# EAGLE schematic 1700-0003_PowerBoard_REV-A (EAGLE 7.7.0)
DRAWING_DATE: 4/15/2022; DRAWING_TITLE: PQI380 UNIV. INTERFACE BRD; PART_NUMBER: 7000-0303; REV: R12

## Sheet 1 of 2
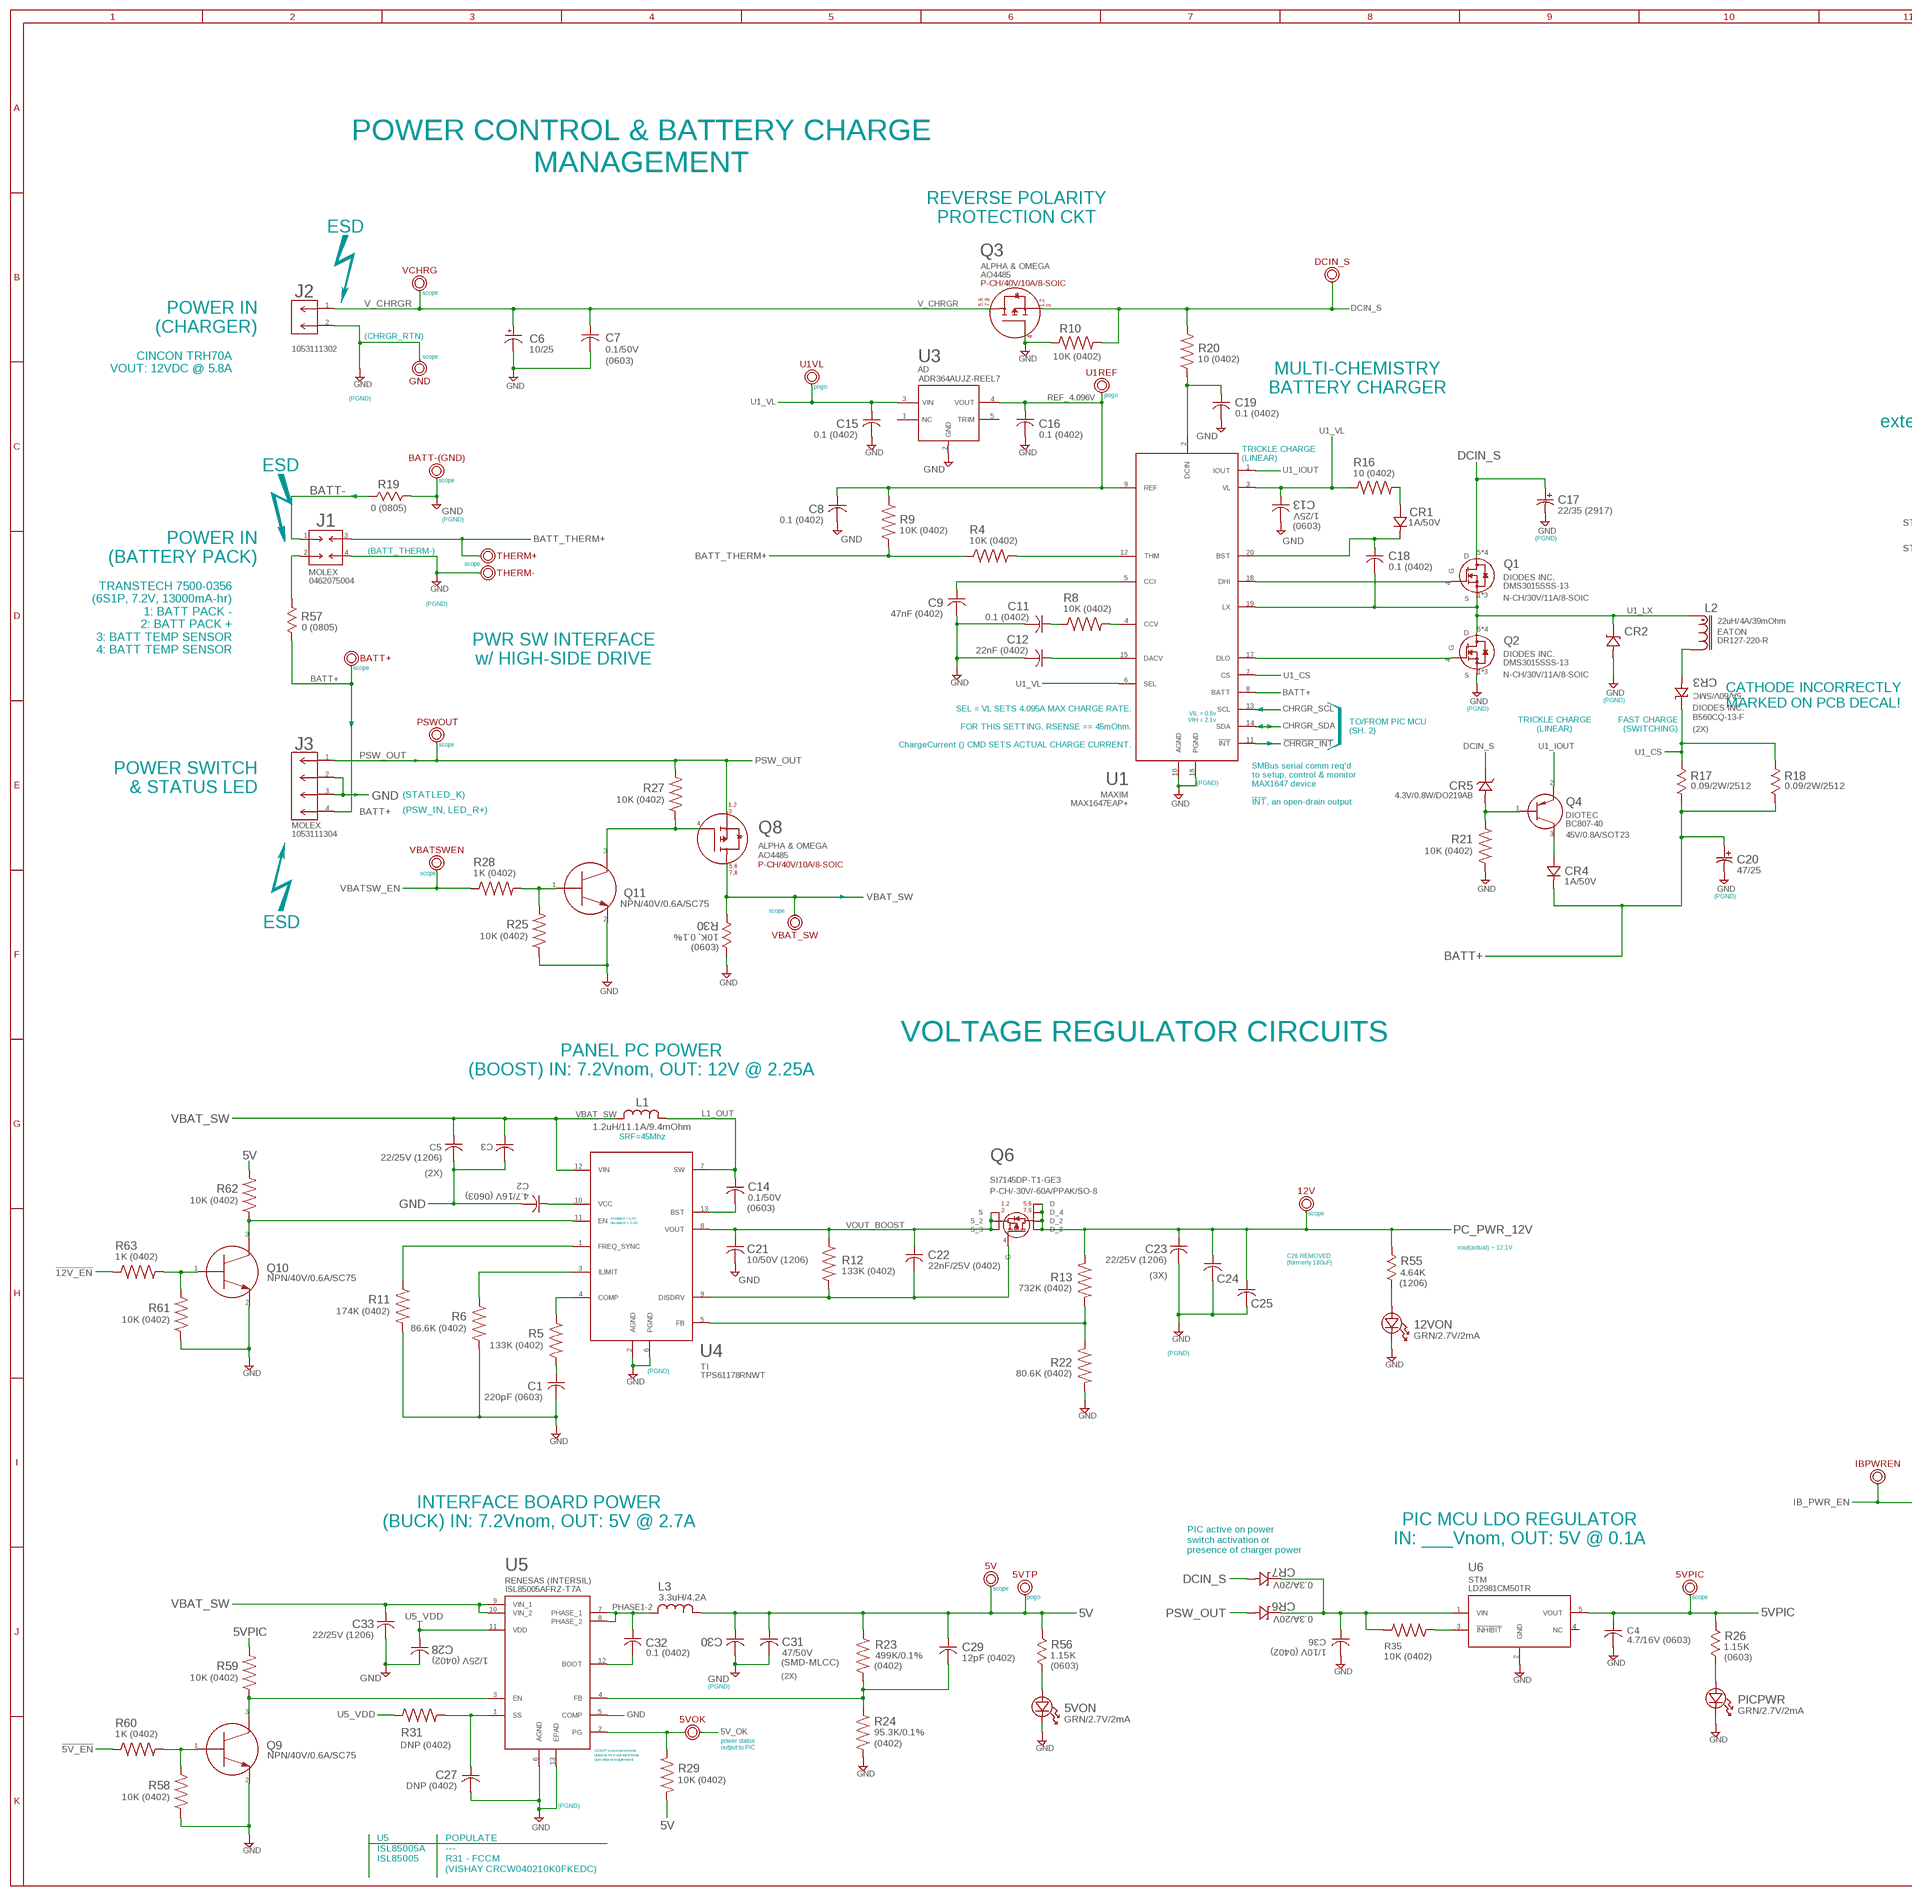
[diagram p0: schematic, sheet 1, part 1 of 2]
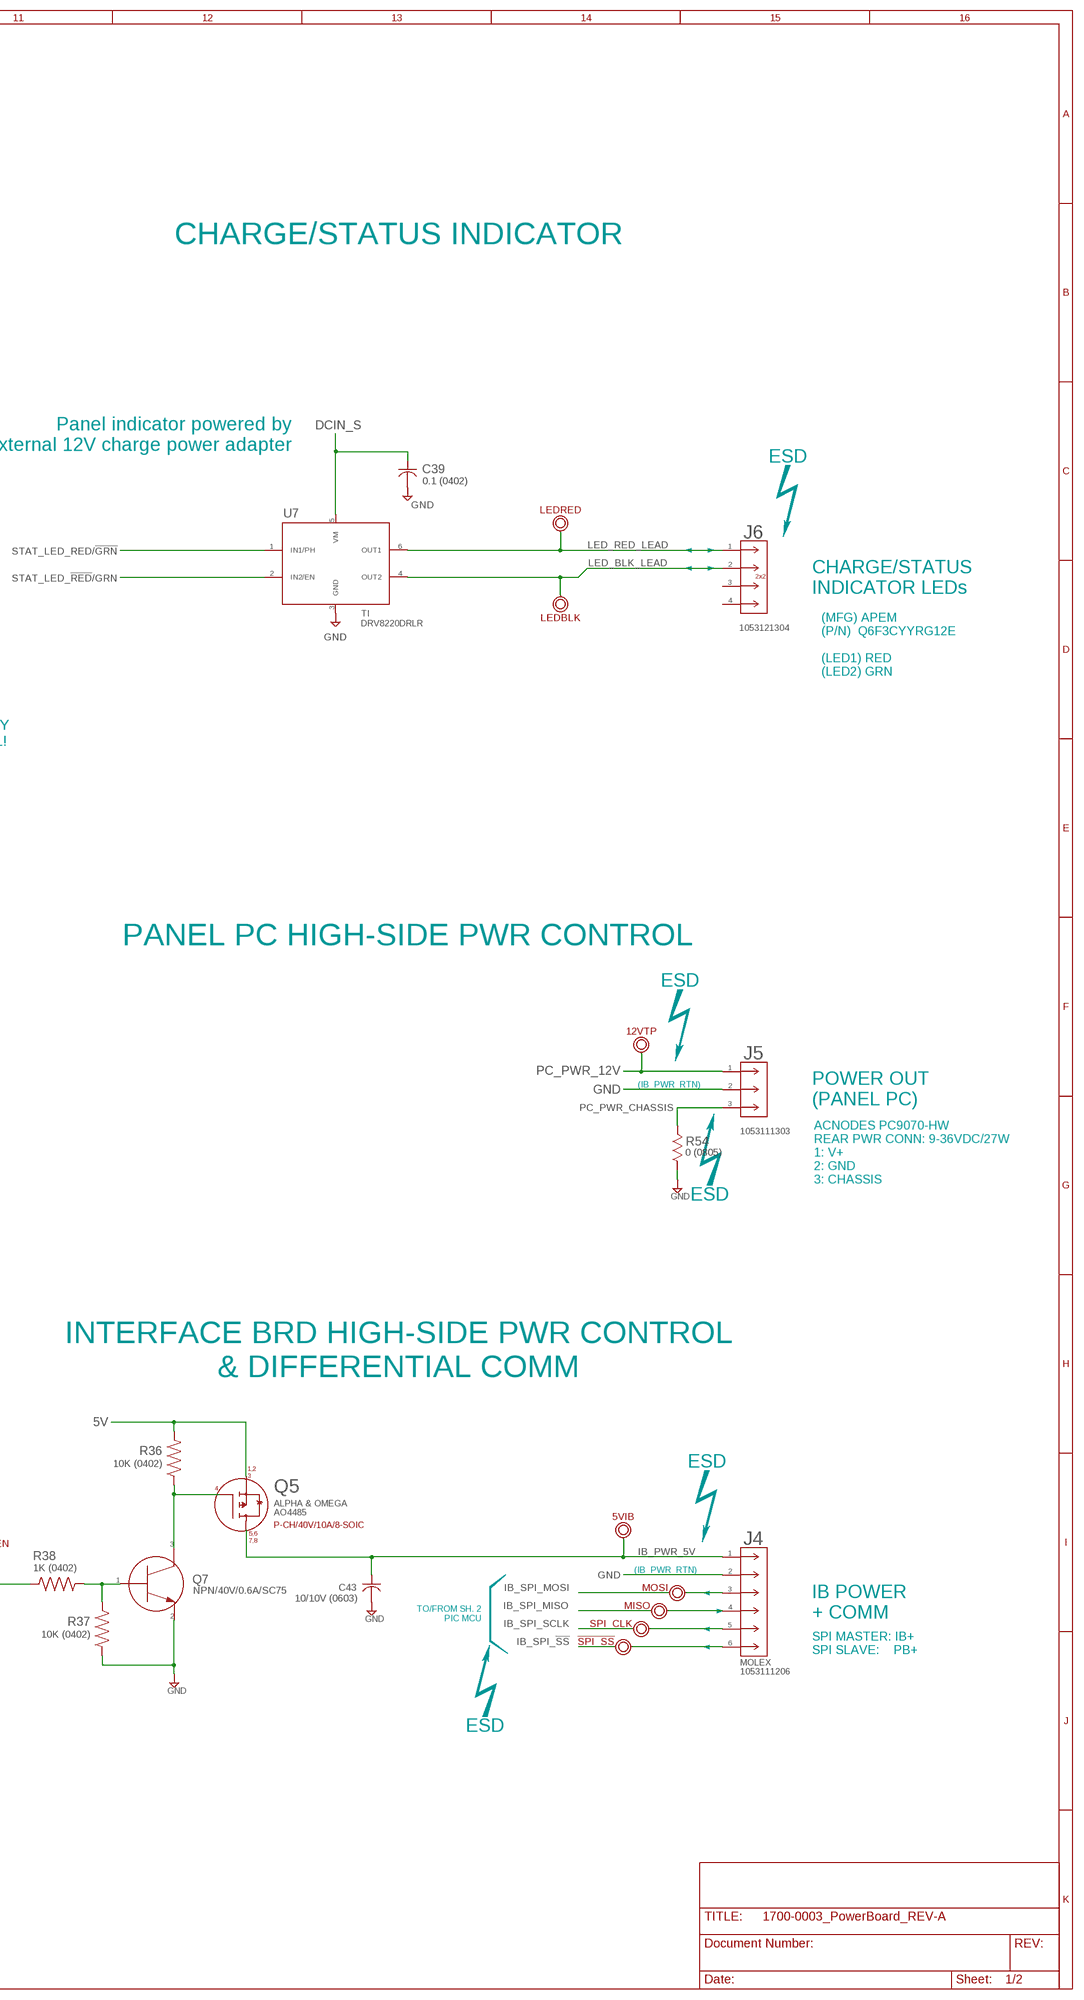
[diagram p1: schematic, sheet 1, part 2 of 2]
FRAME2 (FRAME_D_L): DWG-CO-NAME: TransTech Systems, Inc.; DWG-DATE: 4/22/2022; DWG-NUMBER: ____-____; DWG-REV: R-; DWG-TITLE: PQI380+ POWER BOARD SCHEMATIC; SIZE: D

### Parts
5V  TST_POINT_PTH_042-OCT  [TST_POINT_PTH_042-OCT]
5VIB  TST_POINT_PTH_20X40MIL  [TST_POINT_PTH_20X40MIL]
5VOK  TST_POINT_PTH_20X40MIL_2PIN  [TST_POINT_PTH_20X40MIL_2PIN]
5VON  GRN/2.7V/2mA  LED_0603  [LED_DIALIGHT_598_DIA]
5VPIC  TST_POINT_PTH_042-OCT  [TST_POINT_PTH_042-OCT]
5VTP  TST_POINT_PTH_20X40MIL  [TST_POINT_PTH_20X40MIL]
12V  TST_POINT_PTH_042-OCT  [TST_POINT_PTH_042-OCT]
12VON  GRN/2.7V/2mA  LED_0603  [LED_DIALIGHT_598_DIA]
12VTP  TST_POINT_PTH_20X40MIL  [TST_POINT_PTH_20X40MIL]
!SPI_SS!  TST_POINT_PTH_042_2PIN  [TST_POINT_PTH_042-OCT_2PIN]
BATT+  TST_POINT_PTH_042-OCT  [TST_POINT_PTH_042-OCT]
BATT-(GND)  TST_POINT_PTH_042-OCT  [TST_POINT_PTH_042-OCT]
C1  220pF (0603)  CAP_CER_0603_TDK  [CAP_C1608_TDK]
C2  4.7/16V (0603)  CAP_CER_0603_TDK  [CAP_C1608_TDK]
C3  22/25V (1206)  CAP_CER_1206_SAMSUNG  [CAP_CL31_SAM]
C4  4.7/16V (0603)  CAP_CER_0603_TDK  [CAP_C1608_TDK]
C5  22/25V (1206)  CAP_CER_1206_SAMSUNG  [CAP_CL31_SAM]
C6  10/25  CAP_SMT_EL_CORNELL-DUB_AFK106M25B12T-FCAP_AFK106M25B12T-F_CND-L  [CAP_AFK106M25B12T-F_CND-L]
C7  0.1/50V  CAP_CER_0603_TDK  [CAP_C1608_TDK]
C8  0.1 (0402)  CAP_CER_0402_MURATA  [G-155_MUR]
C9  47nF (0402)  CAP_CER_0402_MURATA  [G-155_MUR]
C11  0.1 (0402)  CAP_CER_0402_MURATA  [G-155_MUR]
C12  22nF (0402)  CAP_CER_0402_MURATA  [G-155_MUR]
C13  1/25V  CAP_CER_0603_TDK  [CAP_C1608_TDK]
C14  0.1/50V  CAP_CER_0603_TDK  [CAP_C1608_TDK]
C15  0.1 (0402)  CAP_CER_0402_MURATA  [G-155_MUR]
C16  0.1 (0402)  CAP_CER_0402_MURATA  [G-155_MUR]
C17  22/35 (2917)  CAP_TANT_KEMET_2917  [CAPMP7.6X4.3_3.1N_KEM]
C18  0.1 (0402)  CAP_CER_0402_MURATA  [G-155_MUR]
C19  0.1 (0402)  CAP_CER_0402_MURATA  [G-155_MUR]
C20  47/25  CAP_TANTALUM_KEMET_T495D  [CAPMP7.6X4.3_3.1N_KEM]
C21  10/50V (1206)  CAP_CER_1206_SAMSUNG  [CAP_CL31_SAM]
C22  22nF/25V (0402)  CAP_CER_0402_MURATA  [G-155_MUR]
C23  22/25V (1206)  CAP_CER_1206_SAMSUNG  [CAP_CL31_SAM]
C24  22/25V (1206)  CAP_CER_1206_SAMSUNG  [CAP_CL31_SAM]
C25  22/25V (1206)  CAP_CER_1206_SAMSUNG  [CAP_CL31_SAM]
C27  DNP (0402)  CAP_CER_0402_MURATA  [G-155_MUR]
C28  1/25V (0402)  CAP_CER_0402_MURATA  [G-155_MUR]
C29  12pF (0402)  CAP_CER_0402_MURATA  [G-155_MUR]
C30  47/50V (MLCC-SMD)  CAP_CER_TDK_CKG57  [CAP_CKG57N_TDK]
C31  47/50V  CAP_CER_TDK_CKG57  [CAP_CKG57N_TDK]
C32  0.1 (0402)  CAP_CER_0402_MURATA  [G-155_MUR]
C33  22/25V (1206)  CAP_CER_1206_SAMSUNG  [CAP_CL31_SAM]
C36  1/10V (0402)  CAP_CER_0402_MURATA  [G-155_MUR]
C39  0.1 (0402)  CAP_CER_0402_MURATA  [G-155_MUR]
C43  10/10V (0603)  CAP_CER_0603_TDK  [CAP_C1608_TDK]
CR1  1A/50V  DIODE_SMA  [SMA_DIO]
CR2  5A/60V/SMC  DIODE_SCHOTTKY_SMC  [CR_0CQ-13-F_DIO]
CR3  5A/60V/SMC  DIODE_SCHOTTKY_SMC  [CR_0CQ-13-F_DIO]
CR4  1A/50V  DIODE_SMA  [SMA_DIO]
CR5  4.3V/0.8W/DO219AB  DIODE_ZENER_VISHAY_BZD27C4V3P-E3-08  [DIO_BZD27C4V3P_VIS]
CR6  0.3A/20V  DIODE_SCHOTTKY_TOSHIBA_1SS404  [USC_TOS]
CR7  0.3A/20V  DIODE_SCHOTTKY_TOSHIBA_1SS404  [USC_TOS]
DCIN_S  TST_POINT_PTH_042-OCT  [TST_POINT_PTH_042-OCT]
GND  TST_POINT_PTH_042-OCT  [TST_POINT_PTH_042-OCT]
IBPWREN  TST_POINT_PTH_042-OCT  [TST_POINT_PTH_042-OCT]
J1  MOLEX_MINI-FIT-JR_462075004  [MOLEX_462075004]
J2  MOLEX_NANO-FIT_1053111302  [CON_1053111302_MOL]
J3  MOLEX_NANO-FIT_1053111304  [CON_1053111304_MOL]
J4  MOLEX_1053111206  [CON_1053111206_MOL]
J5  MOLEX_NANO-FIT_1053111303  [CON_1053111303_MOL]
J6  CON_MOLEX_NANOFIT_1053121304  [CON_1053121304]
L1  1.2uH/11.1A/9.4mOhm  INDUCTOR_COILCRAFT_XAL5030  [IND_XAL50XX_COC]
L2  22uH/4A/39mOhm  INDUCTOR_PWR_EATON_DR127-220-R  [DR127]
L3  3.3uH/4.2A  INDUCTOR_EATON_DRA74  [IND_CB_DRA74]
LEDBLK  TST_POINT_PTH_20X40MIL  [TST_POINT_PTH_20X40MIL]
LEDRED  TST_POINT_PTH_20X40MIL  [TST_POINT_PTH_20X40MIL]
MISO  TST_POINT_PTH_042_2PIN  [TST_POINT_PTH_042-OCT_2PIN]
MOSI  TST_POINT_PTH_042_2PIN  [TST_POINT_PTH_042-OCT_2PIN]
PICPWR  GRN/2.7V/2mA  LED_0603  [LED_DIALIGHT_598_DIA]
PSWOUT  TST_POINT_PTH_042-OCT  [TST_POINT_PTH_042-OCT]
Q1  N-CH/30V/11A/8-SOIC  MOSFET_N-CH_DIODES-INC_DMS3015SSS-13  [SOIC127P600X175-8N]
Q2  N-CH/30V/11A/8-SOIC  MOSFET_N-CH_DIODES-INC_DMS3015SSS-13  [SOIC127P600X175-8N]
Q3  P-CH/40V/10A/8-SOIC  MOSFET_P-CH_ALPHA&OMEGA_AO4485  [SOIC127P600X175-8N]
Q4  45V/0.8A/SOT23  TRANS_PNP_SOT-23-3_DIOTEC  [SOT-23-3_DIOTEC]
Q5  P-CH/40V/10A/8-SOIC  MOSFET_P-CH_ALPHA&OMEGA_AO4485  [SOIC127P600X175-8N]
Q6  P-CH/-30V/-60A/PPAK/SO-8  MOSFET_P-CH_VISHAY_SI7145DP-T1-GE3  [SON8_SI7135DP-T1-GE3_VIS]
Q7  NPN/40V/0.6A/SC75  MMBT2222ATT3G  [SC-75(SOT-416)_ONSEMI]
Q8  P-CH/40V/10A/8-SOIC  MOSFET_P-CH_ALPHA&OMEGA_AO4485  [SOIC127P600X175-8N]
Q9  NPN/40V/0.6A/SC75  MMBT2222ATT3G  [SC-75(SOT-416)_ONSEMI]
Q10  NPN/40V/0.6A/SC75  MMBT2222ATT3G  [SC-75(SOT-416)_ONSEMI]
Q11  NPN/40V/0.6A/SC75  MMBT2222ATT3G  [SC-75(SOT-416)_ONSEMI]
R4  10K (0402)  RES_0402_VISHAY  [RESC1005X35N]
R5  133K (0402)  RES_0402_VISHAY  [RESC1005X35N]
R6  86.6K (0402)  RES_0402_VISHAY  [RESC1005X35N]
R8  10K (0402)  RES_0402_VISHAY  [RESC1005X35N]
R9  10K (0402)  RES_0402_VISHAY  [RESC1005X35N]
R10  10K (0402)  RES_0402_VISHAY  [RESC1005X35N]
R11  174K (0402)  RES_0402_VISHAY  [RESC1005X35N]
R12  133K (0402)  RES_0402_VISHAY  [RESC1005X35N]
R13  732K (0402)  RES_0402_VISHAY  [RESC1005X35N]
R16  10 (0402)  RES_0402_VISHAY  [RESC1005X35N]
R17  0.09/2W/2512  RES_2512_TECONN  [RES_2512_TECONN]
R18  0.09/2W/2512  RES_2512_TECONN  [RES_2512_TECONN]
R19  0 (0805)  RES_0805_STACKPOLE  [STA_HCJ0805_STP]
R20  10 (0402)  RES_0402_VISHAY  [RESC1005X35N]
R21  10K (0402)  RES_0402_VISHAY  [RESC1005X35N]
R22  80.6K (0402)  RES_0402_VISHAY  [RESC1005X35N]
R23  499K/0.1%  RES_0402_VISHAY  [RESC1005X35N]
R24  95.3K/0.1%  RES_0402_VISHAY  [RESC1005X35N]
R25  10K (0402)  RES_0402_VISHAY  [RESC1005X35N]
R26  1.15K  RES_0603_STACKPOLE  [STA_RMCF0603_STP]
R27  10K (0402)  RES_0402_VISHAY  [RESC1005X35N]
R28  1K (0402)  RES_0402_VISHAY  [RESC1005X35N]
R29  10K (0402)  RES_0402_VISHAY  [RESC1005X35N]
R30  10K, 0.1%  RES_0603_STACKPOLE  [STA_RMCF0603_STP]
R31  DNP (0402)  RES_0402_VISHAY  [RESC1005X35N]
R35  10K (0402)  RES_0402_VISHAY  [RESC1005X35N]
R36  10K (0402)  RES_0402_VISHAY  [RESC1005X35N]
R37  10K (0402)  RES_0402_VISHAY  [RESC1005X35N]
R38  1K (0402)  RES_0402_VISHAY  [RESC1005X35N]
R54  0 (0805)  RES_0805_STACKPOLE  [STA_HCJ0805_STP]
R55  4.64K  RES_1206_YAGEO  [RC1206N_YAG]
R56  1.15K  RES_0603_STACKPOLE  [STA_RMCF0603_STP]
R57  0 (0805)  RES_0805_STACKPOLE  [STA_HCJ0805_STP]
R58  10K (0402)  RES_0402_VISHAY  [RESC1005X35N]
R59  10K (0402)  RES_0402_VISHAY  [RESC1005X35N]
R60  1K (0402)  RES_0402_VISHAY  [RESC1005X35N]
R61  10K (0402)  RES_0402_VISHAY  [RESC1005X35N]
R62  10K (0402)  RES_0402_VISHAY  [RESC1005X35N]
R63  1K (0402)  RES_0402_VISHAY  [RESC1005X35N]
SPI_CLK  TST_POINT_PTH_042_2PIN  [TST_POINT_PTH_042-OCT_2PIN]
THERM+  TST_POINT_PTH_042-OCT  [TST_POINT_PTH_042-OCT]
THERM-  TST_POINT_PTH_042-OCT  [TST_POINT_PTH_042-OCT]
U1  MAX1647EAP+  [21-0056C_20_MXM]
U1REF  TST_POINT_PTH_20X40MIL  [TST_POINT_PTH_20X40MIL]
U1VL  TST_POINT_PTH_20X40MIL  [TST_POINT_PTH_20X40MIL]
U3  AD_REFERENCE_ADR364AUJZ-REEL7  [UJ_5_ADI]
U4  REGULATOR_BOOST_TI_TPS61178RNWT  [RNW0013A]
U5  REGULATOR_BUCK_RENESAS_ISL85005AFRZ-T7A  [SON50P300X400X90-13N]
U6  IC_LDO_STM_LD2981CM50TR  [SOT23-5L_STM]
U7  IC_H-BRIDGE_TI_DRV8220DRLR  [SOT5X3-6_DRL_TEX]
VBAT_SW  TST_POINT_PTH_042-OCT  [TST_POINT_PTH_042-OCT]
VBATSWEN  TST_POINT_PTH_042-OCT  [TST_POINT_PTH_042-OCT]
VCHRG  TST_POINT_PTH_042-OCT  [TST_POINT_PTH_042-OCT]

### Nets
5V: 5V.P$1 5VTP.P$1 C29.1 C30.1 C31.1 L3.1 Q5.1(S) Q5.2(S) Q5.3(S) R23.1 R29.1 R36.2 R56.2 R62.2 ; also sheet 2
5V_OK: 5VOK.P$1 5VOK.P$2 R29.2 U5.2(PG) ; also sheet 2
5VPIC: 5VPIC.P$1 C4.1 R26.2 R59.2 U6.5(VOUT) ; also sheet 2
!5V_EN!: R60.1 ; also sheet 2
!12V_EN!: R63.1 ; also sheet 2
!CHRGR_INT!: U1.11(!INT) ; also sheet 2
$N36: C36.1 CR6.1(K) CR7.1(K) R35.2 U6.1(VIN)
$N99: J1.2 R57.2
BATT+: BATT+.P$1 C20.1 CR4.1 J3.4 R17.2 R18.2 R57.1 U1.8(BATT)
BATT-: J1.1 R19.2
BATT_THERM+: J1.3 R4.1 R9.2 THERM+.P$1
CHRGR_SCL: U1.13(SCL) ; also sheet 2
CHRGR_SDA: U1.14(SDA) ; also sheet 2
DCIN_S: C17.1 C39.1 CR5.2(K) CR7.2(A) DCIN_S.P$1 Q1.5(D) Q1.6(D) Q1.7(D) Q1.8(D) Q3.1(S) Q3.2(S) Q3.3(S) R10.2 R20.2 U7.5(VM) ; also sheet 2
GND: 5VON.1 12VON.1 BATT-(GND).P$1 C1.2 C2.2 C3.2 C4.2 C5.2 C6.2 C7.2 C8.2 C9.2 C11.2 C12.2 C13.2 C15.2 C16.2 C17.2 C19.2 C20.2 C21.2 C23.2 C24.2 C25.2 C27.2 C28.2 C30.2 C31.2 C33.2 C36.2 C39.2 C43.2 CR2.1(A) GND.P$1 J1.4 J2.2 J3.2 J3.3 J4.2 J5.2 PICPWR.1 Q2.1(S) Q2.2(S) Q2.3(S) Q3.4(G) Q7.2(E) Q9.2(E) Q10.2(E) Q11.2(E) R6.2 R10.1 R11.2 R19.1 R21.2 R22.2 R24.2 R25.1 R30.2 R37.1 R54.2 R58.1 R61.1 THERM-.P$1 U1.10(AGND) U1.16(PGND) U3.2(GND) U4.2(AGND) U4.6(PGND) U5.5(COMP) U5.6(AGND) U5.13(EPAD) U6.2(GND) U7.3(GND) ; also sheet 2
IB_PWR_5V: 5VIB.P$1 C43.1 J4.1 Q5.5(D) Q5.6(D) Q5.7(D) Q5.8(D)
IB_PWR_EN: IBPWREN.P$1 R38.1 ; also sheet 2
IB_SPI_!SS: !SPI_SS!.P$1 !SPI_SS!.P$2 J4.6 ; also sheet 2
IB_SPI_MISO: J4.4 MISO.P$1 MISO.P$2 ; also sheet 2
IB_SPI_MOSI: J4.3 MOSI.P$1 MOSI.P$2 ; also sheet 2
IB_SPI_SCLK: J4.5 SPI_CLK.P$1 SPI_CLK.P$2 ; also sheet 2
L1_OUT: C14.1 L1.1 U4.7(SW)
LED_BLK_LEAD: J6.2 LEDBLK.P$1 U7.4(OUT2)
LED_RED_LEAD: J6.1 LEDRED.P$1 U7.6(OUT1)
N$1: R5.1 U4.4(COMP)
N$2: C19.1 R20.1 U1.2(DCIN)
N$3: Q1.4(G) U1.18(DHI)
N$4: C1.1 R5.2
N$5: R4.2 U1.12(THM)
N$6: R6.1 U4.3(ILIMIT)
N$7: C2.1 U4.10(VCC)
N$8: R11.1 U4.1(FREQ_SYNC)
N$10: C9.1 U1.5(CCI)
N$11: R8.2 U1.4(CCV)
N$12: C11.1 R8.1
N$13: C12.1 U1.15(DACV)
N$14: CR4.2 Q4.3(C)
N$15: CR1.2 R16.2
N$16: Q2.4(G) U1.17(DLO)
N$17: C18.1 CR1.1 U1.20(BST)
N$18: CR3.1(A) L2.2
N$19: C14.2 U4.13(BST)
N$20: C22.2 Q6.4(G) R12.2 U4.9(DISDRV)
N$21: CR5.1(A) Q4.1(B) R21.1
N$22: Q8.4(G) Q11.3(C) R27.1
N$23: C27.1 R31.2 U5.1(SS)
N$24: R13.2 R22.1 U4.5(FB)
N$28: C32.2 U5.12(BOOT)
N$29: C29.2 R23.2 R24.1 U5.4(FB)
N$30: 5VON.2 R56.1
N$32: R35.1 U6.3(!INHIBIT!)
N$33: Q11.1(B) R25.2 R28.2
N$40: Q5.4(G) Q7.3(C) R36.1
N$41: Q7.1(B) R37.2 R38.2
N$63: 12VON.2 R55.2
N$64: PICPWR.2 R26.1
N$65: Q9.1(B) R58.2 R60.2
N$66: Q9.3(C) R59.1 U5.3(EN)
N$67: Q10.3(C) R62.1 U4.11(EN)
N$68: Q10.1(B) R61.2 R63.2
PC_PWR_12V: 12V.P$1 12VTP.P$1 C23.1 C24.1 C25.1 J5.1 Q6.5(D_3) Q6.6(D_2) Q6.7(D_4) Q6.8(D) R13.1 R55.1 ; also sheet 2
PC_PWR_CHASSIS: J5.3 R54.1
PHASE1-2: C32.1 L3.2 U5.7(PHASE_1) U5.8(PHASE_2)
PSW_OUT: CR6.2(A) J3.1 PSWOUT.P$1 Q8.1(S) Q8.2(S) Q8.3(S) R27.2 ; also sheet 2
REF_4.096V: C8.1 C16.1 R9.1 U1.9(REF) U1REF.P$1 U3.4(VOUT)
STAT_LED_!RED!/GRN: U7.2(IN2/EN) ; also sheet 2
STAT_LED_RED/!GRN!: U7.1(IN1/PH) ; also sheet 2
U1_CS: CR3.2(K) R17.1 R18.1 U1.7(CS)
U1_IOUT: Q4.2(E) U1.1(IOUT)
U1_LX: C18.2 CR2.2(K) L2.1 Q1.1(S) Q1.2(S) Q1.3(S) Q2.5(D) Q2.6(D) Q2.7(D) Q2.8(D) U1.19(LX)
U1_VL: C13.1 C15.1 R16.1 U1.3(VL) U1.6(SEL) U1VL.P$1 U3.3(VIN)
U5_VDD: C28.1 R31.1 U5.11(VDD)
V_CHRGR: C6.1 C7.1 J2.1 Q3.5(D) Q3.6(D) Q3.7(D) Q3.8(D) VCHRG.P$1
VBAT_SW: C3.1 C5.1 C33.1 L1.2 Q8.5(D) Q8.6(D) Q8.7(D) Q8.8(D) R30.1 U4.12(VIN) U5.9(VIN_1) U5.10(VIN_2) VBAT_SW.P$1
VBATSW_EN: R28.1 VBATSWEN.P$1 ; also sheet 2
VOUT_BOOST: C21.1 C22.1 Q6.1(S_3) Q6.2(S_2) Q6.3(S) R12.1 U4.8(VOUT)
Unconnected: J6.3 J6.4 U3.1(NC) U3.5(TRIM) U6.4(NC)

### Notes on the sheet
- POWER CONTROL & BATTERY CHARGE
  MANAGEMENT
- REVERSE POLARITY
  PROTECTION CKT
- ESD | CHARGE/STATUS INDICATOR
- scope
- POWER IN
  (CHARGER)
- (CHRGR_RTN)
- CINCON TRH70A
  VOUT: 12VDC @ 5.8A
- scope
- pogo
- MULTI-CHEMISTRY
  BATTERY CHARGER
- pogo
- (PGND)
- Panel indicator powered by
  external 12V charge power adapter
- ESD
- TRICKLE CHARGE
  (LINEAR)
- ESD
- scope
- (PGND)
- (PGND)
- POWER IN
  (BATTERY PACK)
- CHARGE/STATUS
  INDICATOR LEDs
- (BATT_THERM-)
- scope
- TRANSTECH 7500-0356
  (6S1P, 7.2V, 13000mA-hr)
  1: BATT PACK -
  2: BATT PACK +
  3: BATT TEMP SENSOR
  4: BATT TEMP SENSOR
- (MFG) APEM
  (P/N)  Q6F3CYYRG12E
  
  (LED1) RED
  (LED2) GRN
- (PGND)
- PWR SW INTERFACE
  w/ HIGH-SIDE DRIVE
- scope
- (PGND)
- CATHODE INCORRECTLY
  MARKED ON PCB DECAL!
- (PGND)
- TRICKLE CHARGE
  (LINEAR)
- FAST CHARGE
  (SWITCHING)
- VIL = 0.8v
  VIH = 2.1v
- TO/FROM PIC MCU
  (SH. 2)
- scope
- SEL = VL SETS 4.095A MAX CHARGE RATE.
  
  FOR THIS SETTING, RSENSE == 45mOhm.
  
  ChargeCurrent () CMD SETS ACTUAL CHARGE CURRENT.
- SMBus serial comm req'd
  to setup, control & monitor
  MAX1647 device
  
  !INT!, an open-drain output
- POWER SWITCH
  & STATUS LED
- (PGND)
- (STATLED_K)
- (PSW_IN, LED_R+)
- scope
- (PGND) | PANEL PC HIGH-SIDE PWR CONTROL
- scope
- ESD
- ESD
- (IB_PWR_RTN)
- POWER OUT
  (PANEL PC)
- VOLTAGE REGULATOR CIRCUITS
- ACNODES PC9070-HW
  REAR PWR CONN: 9-36VDC/27W
  1: V+
  2: GND
  3: CHASSIS
- PANEL PC POWER
  (BOOST) IN: 7.2Vnom, OUT: 12V @ 2.25A
- ESD
- SRF=45Mhz
- scope
- enabled >1.2V
  disabled < 0.4V
- vout(actual) ~ 12.1V
- C26 REMOVED 
  (formerly 180uF)
- INTERFACE BRD HIGH-SIDE PWR CONTROL
  & DIFFERENTIAL COMM
- (PGND)
- (PGND)
- ESD
- (IB_PWR_RTN)
- IB POWER
  + COMM
- INTERFACE BOARD POWER
  (BUCK) IN: 7.2Vnom, OUT: 5V @ 2.7A
- TO/FROM SH. 2
  PIC MCU
- PIC MCU LDO REGULATOR
  IN: ___Vnom, OUT: 5V @ 0.1A
- PIC active on power
  switch activation or
  presence of charger power
- SPI MASTER: IB+
  SPI SLAVE:    PB+
- scope
- pogo | scope
- ESD
- (PGND)
- power status
  output to PIC
- COMP external network
  optional for extended temp
  operational requirement
- (PGND)
- U5
  ISL85005A
  ISL85005
- POPULATE
  ---
  R31 - FCCM
  (VISHAY CRCW040210K0FKEDC)

## Sheet 2 of 2
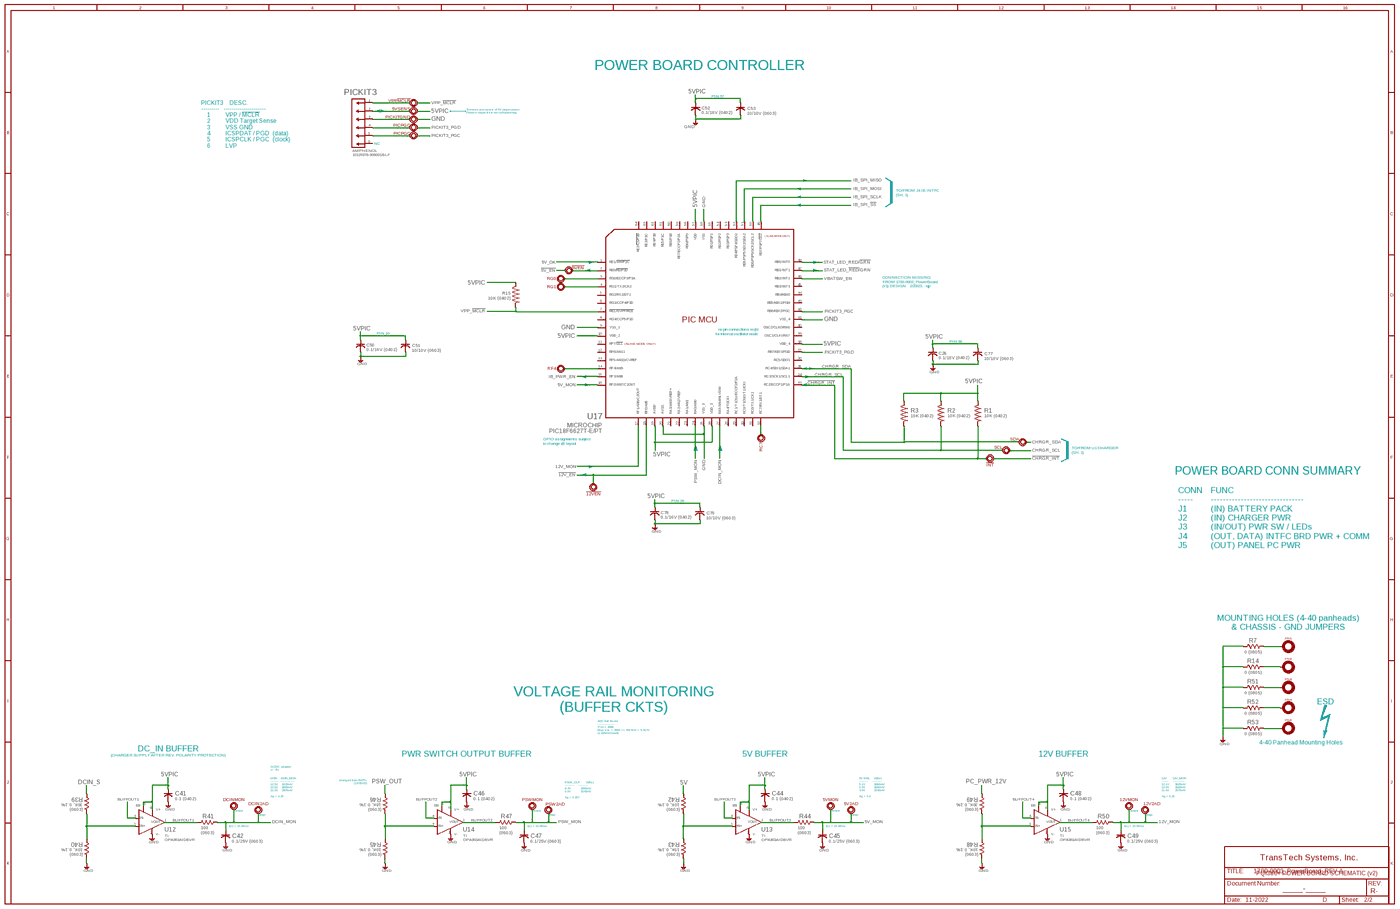
[diagram p2: schematic, sheet 2, overview]
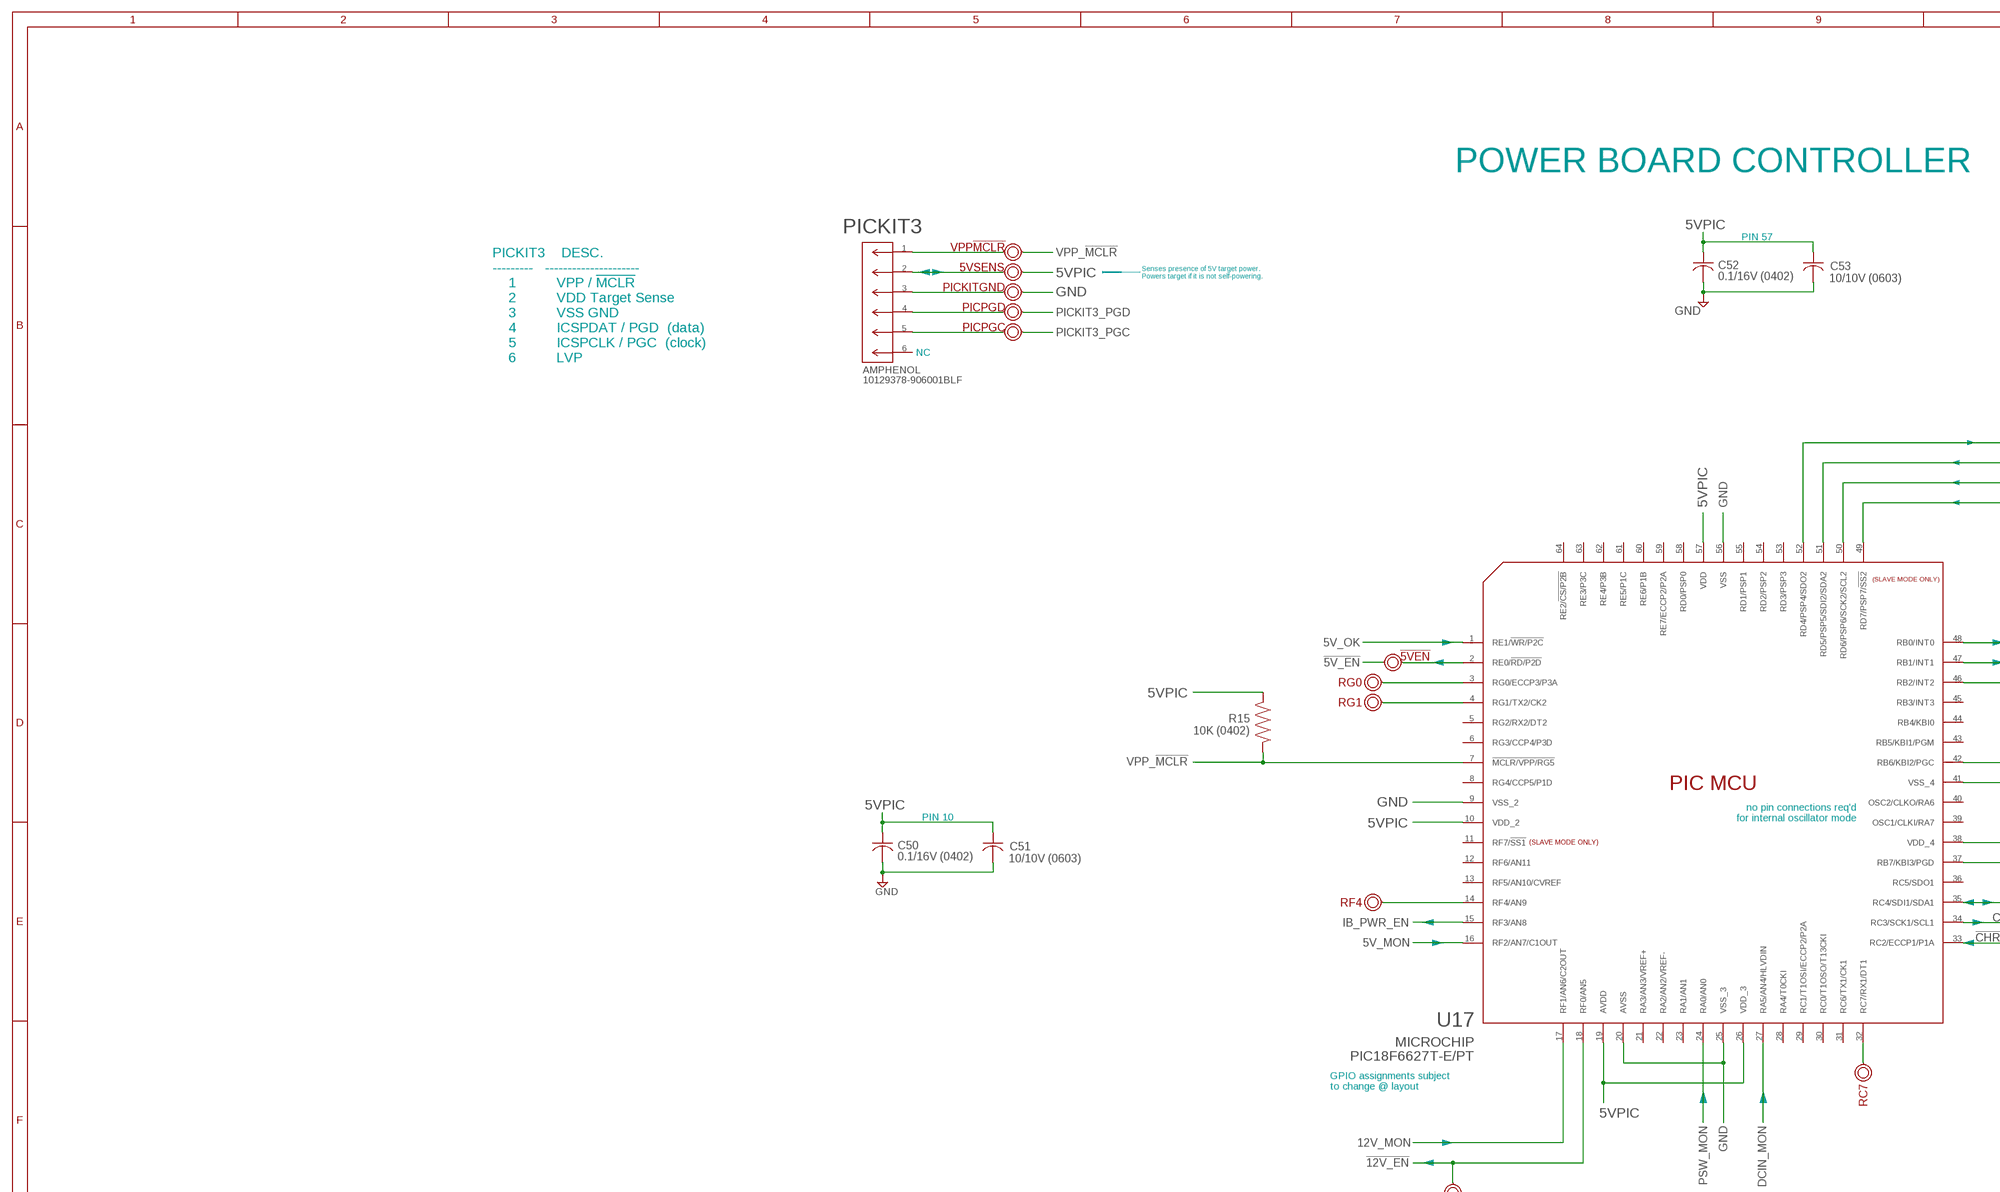
[diagram p3: schematic, sheet 2, part 1 of 4]
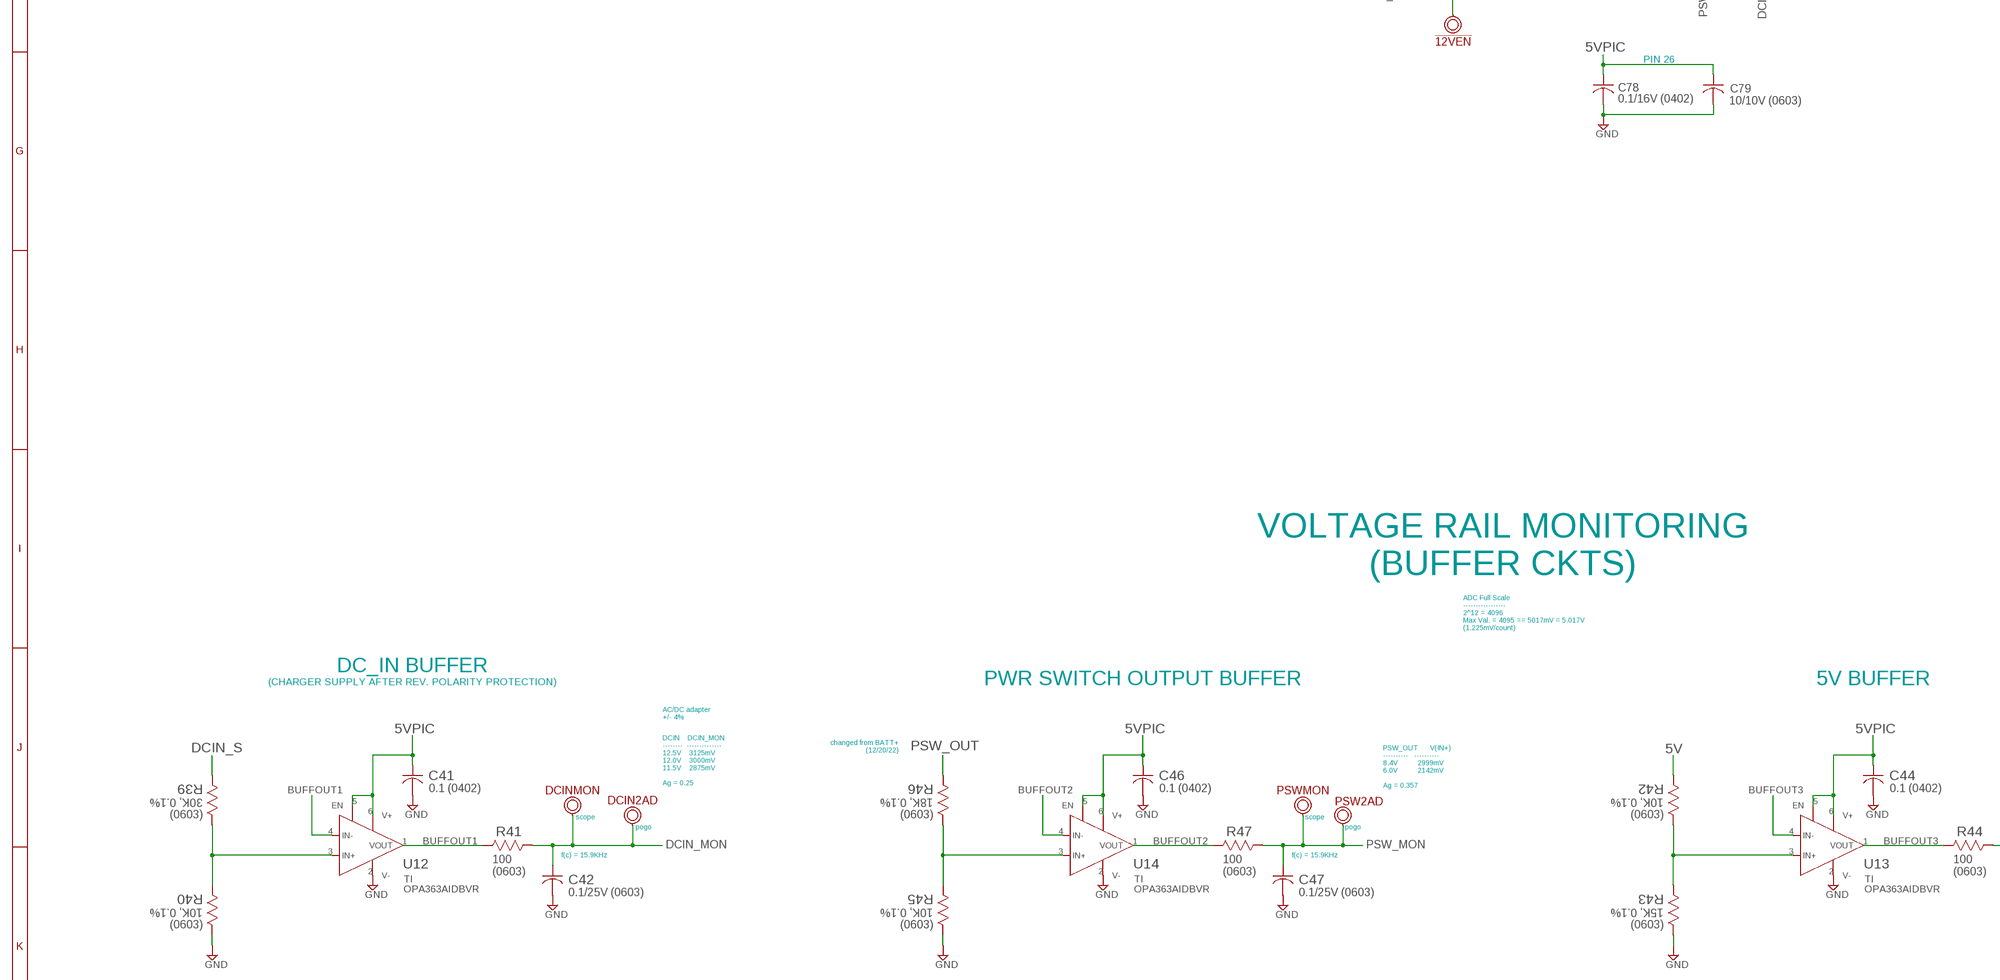
[diagram p4: schematic, sheet 2, part 2 of 4]
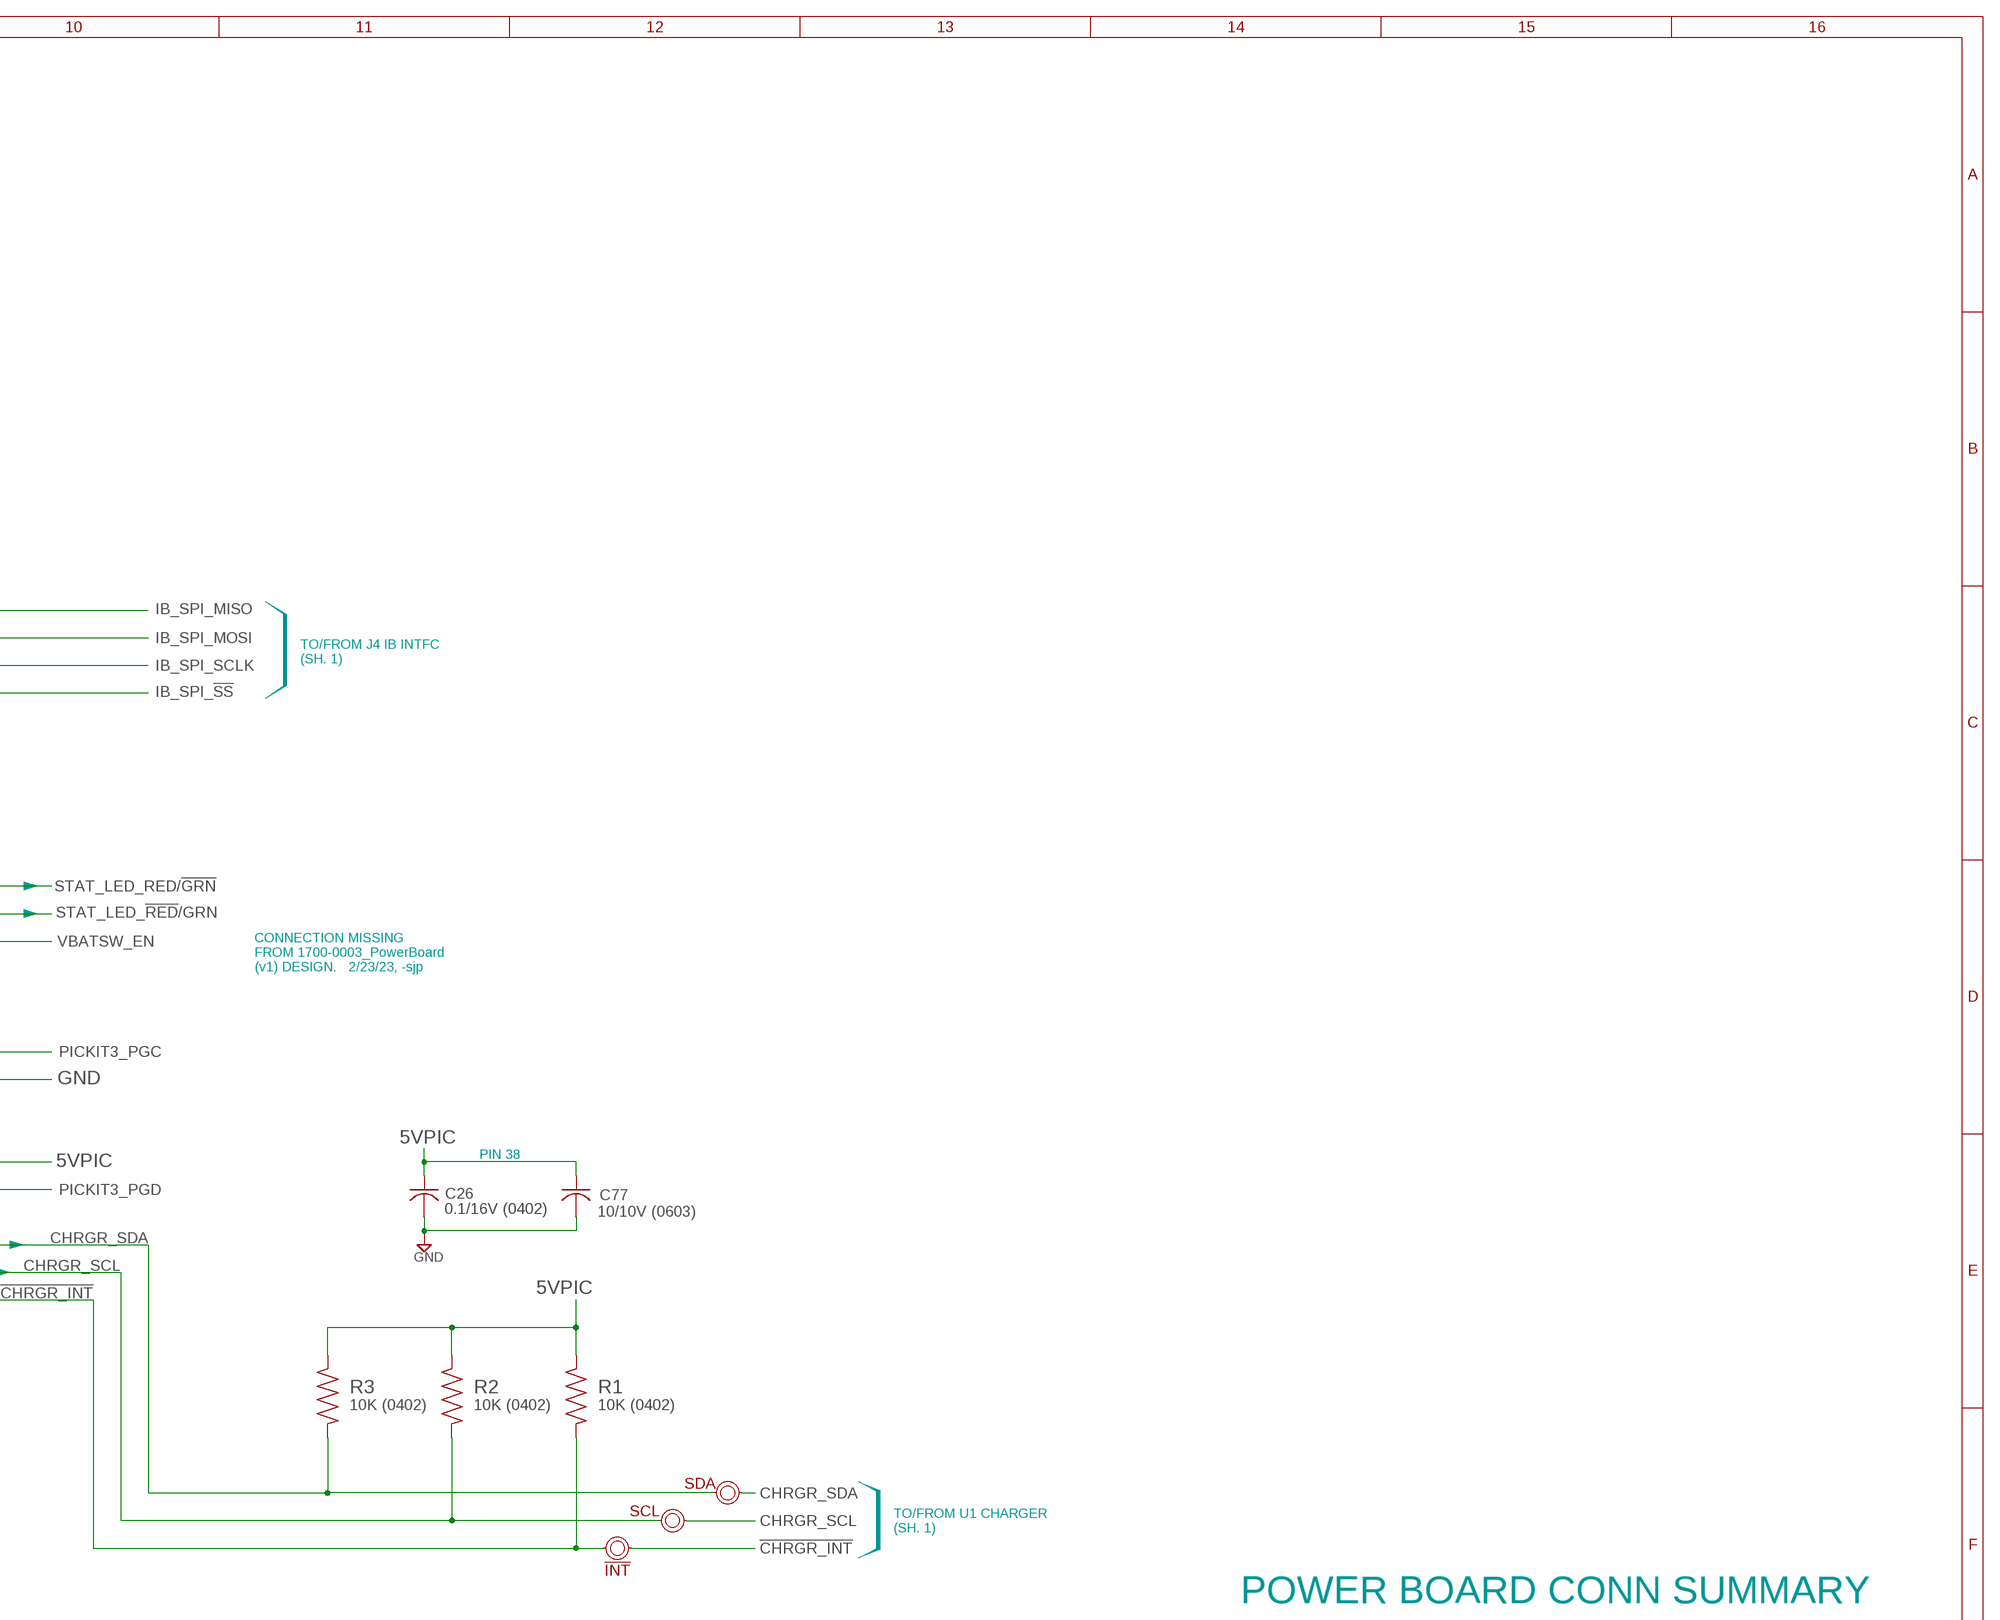
[diagram p5: schematic, sheet 2, part 3 of 4]
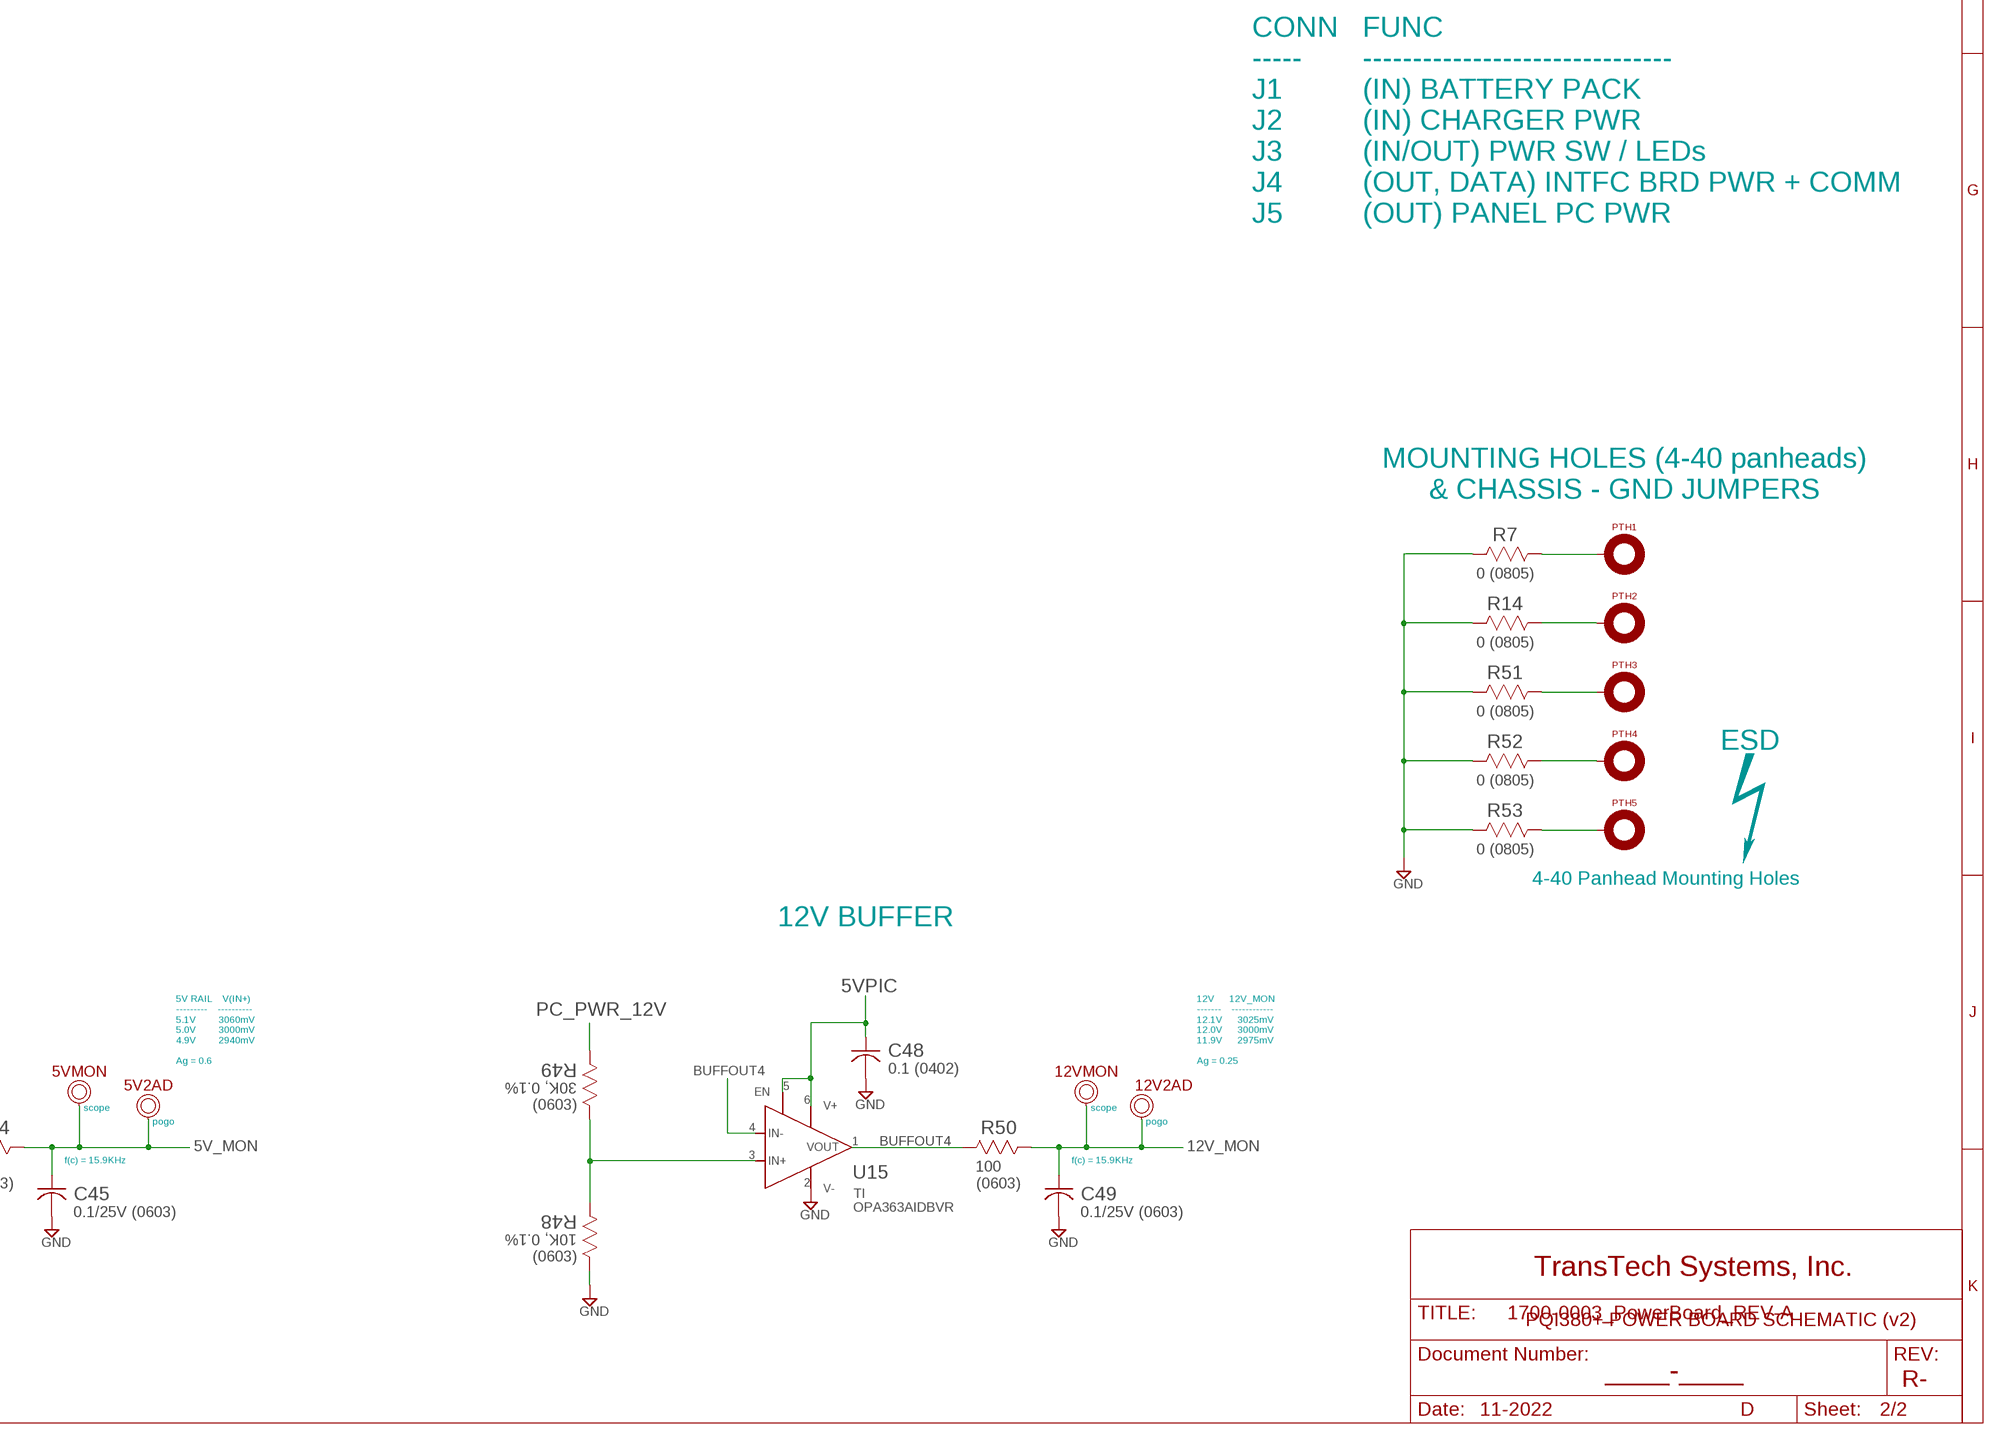
[diagram p6: schematic, sheet 2, part 4 of 4]
FRAME10 (FRAME_D_L): DWG-CO-NAME: TransTech Systems, Inc.; DWG-DATE: 11-2022; DWG-NUMBER: ____-____; DWG-REV: R-; DWG-TITLE: PQI380+ POWER BOARD SCHEMATIC (v2); SIZE: D

### Parts
5V2AD  TST_POINT_PTH_20X40MIL  [TST_POINT_PTH_20X40MIL]
5VMON  TST_POINT_PTH_042-OCT  [TST_POINT_PTH_042-OCT]
5VSENS  TST_POINT_PTH_20X40MIL_2PIN  [TST_POINT_PTH_20X40MIL_2PIN]
12V2AD  TST_POINT_PTH_20X40MIL  [TST_POINT_PTH_20X40MIL]
12VMON  TST_POINT_PTH_042-OCT  [TST_POINT_PTH_042-OCT]
!5VEN  TST_POINT_PTH_20X40MIL_2PIN  [TST_POINT_PTH_20X40MIL_2PIN]
!12VEN  TST_POINT_PTH_20X40MIL  [TST_POINT_PTH_20X40MIL]
!INT!  TST_POINT_PTH_20X40MIL_2PIN  [TST_POINT_PTH_20X40MIL_2PIN]
C26  0.1/16V (0402)  CAP_CER_0402_MURATA  [G-155_MUR]
C41  0.1 (0402)  CAP_CER_0402_MURATA  [G-155_MUR]
C42  0.1/25V (0603)  CAP_CER_0603_TDK  [CAP_C1608_TDK]
C44  0.1 (0402)  CAP_CER_0402_MURATA  [G-155_MUR]
C45  0.1/25V (0603)  CAP_CER_0603_TDK  [CAP_C1608_TDK]
C46  0.1 (0402)  CAP_CER_0402_MURATA  [G-155_MUR]
C47  0.1/25V (0603)  CAP_CER_0603_TDK  [CAP_C1608_TDK]
C48  0.1 (0402)  CAP_CER_0402_MURATA  [G-155_MUR]
C49  0.1/25V (0603)  CAP_CER_0603_TDK  [CAP_C1608_TDK]
C50  0.1/16V (0402)  CAP_CER_0402_MURATA  [G-155_MUR]
C51  10/10V (0603)  CAP_CER_0603_TDK  [CAP_C1608_TDK]
C52  0.1/16V (0402)  CAP_CER_0402_MURATA  [G-155_MUR]
C53  10/10V (0603)  CAP_CER_0603_TDK  [CAP_C1608_TDK]
C77  10/10V (0603)  CAP_CER_0603_TDK  [CAP_C1608_TDK]
C78  0.1/16V (0402)  CAP_CER_0402_MURATA  [G-155_MUR]
C79  10/10V (0603)  CAP_CER_0603_TDK  [CAP_C1608_TDK]
DCIN2AD  TST_POINT_PTH_20X40MIL  [TST_POINT_PTH_20X40MIL]
DCINMON  TST_POINT_PTH_042-OCT  [TST_POINT_PTH_042-OCT]
PICKIT3  CON_6POS_VERT-HDR_AMPH_10129378-906001  [CON6_1X6_VERT-HDR]
PICKITGND  TST_POINT_PTH_20X40MIL_2PIN  [TST_POINT_PTH_20X40MIL_2PIN]
PICPGC  TST_POINT_PTH_20X40MIL_2PIN  [TST_POINT_PTH_20X40MIL_2PIN]
PICPGD  TST_POINT_PTH_20X40MIL_2PIN  [TST_POINT_PTH_20X40MIL_2PIN]
PSW2AD  TST_POINT_PTH_20X40MIL  [TST_POINT_PTH_20X40MIL]
PSWMON  TST_POINT_PTH_042-OCT  [TST_POINT_PTH_042-OCT]
PTH1  PTH_4-40  [PTH_4-40]
PTH2  PTH_4-40  [PTH_4-40]
PTH3  PTH_4-40  [PTH_4-40]
PTH4  PTH_4-40  [PTH_4-40]
PTH5  PTH_4-40  [PTH_4-40]
R1  10K (0402)  RES_0402_VISHAY  [RESC1005X35N]
R2  10K (0402)  RES_0402_VISHAY  [RESC1005X35N]
R3  10K (0402)  RES_0402_VISHAY  [RESC1005X35N]
R7  0 (0805)  RES_0805_STACKPOLE  [STA_HCJ0805_STP]
R14  0 (0805)  RES_0805_STACKPOLE  [STA_HCJ0805_STP]
R15  10K (0402)  RES_0402_VISHAY  [RESC1005X35N]
R39  30K, 0.1%  RES_0603_STACKPOLE  [STA_RMCF0603_STP]
R40  10K, 0.1%  RES_0603_STACKPOLE  [STA_RMCF0603_STP]
R41  100  RES_0603_STACKPOLE  [STA_RMCF0603_STP]
R42  10K, 0.1%  RES_0603_STACKPOLE  [STA_RMCF0603_STP]
R43  15K, 0.1%  RES_0603_STACKPOLE  [STA_RMCF0603_STP]
R44  100  RES_0603_STACKPOLE  [STA_RMCF0603_STP]
R45  10K, 0.1%  RES_0603_STACKPOLE  [STA_RMCF0603_STP]
R46  18K, 0.1%  RES_0603_STACKPOLE  [STA_RMCF0603_STP]
R47  100  RES_0603_STACKPOLE  [STA_RMCF0603_STP]
R48  10K, 0.1%  RES_0603_STACKPOLE  [STA_RMCF0603_STP]
R49  30K, 0.1%  RES_0603_STACKPOLE  [STA_RMCF0603_STP]
R50  100  RES_0603_STACKPOLE  [STA_RMCF0603_STP]
R51  0 (0805)  RES_0805_STACKPOLE  [STA_HCJ0805_STP]
R52  0 (0805)  RES_0805_STACKPOLE  [STA_HCJ0805_STP]
R53  0 (0805)  RES_0805_STACKPOLE  [STA_HCJ0805_STP]
RC7  TST_POINT_PTH_042-OCT  [TST_POINT_PTH_042-OCT]
RF4  TST_POINT_PTH_042-OCT  [TST_POINT_PTH_042-OCT]
RG0  TST_POINT_PTH_042-OCT  [TST_POINT_PTH_042-OCT]
RG1  TST_POINT_PTH_042-OCT  [TST_POINT_PTH_042-OCT]
SCL  TST_POINT_PTH_20X40MIL_2PIN  [TST_POINT_PTH_20X40MIL_2PIN]
SDA  TST_POINT_PTH_20X40MIL_2PIN  [TST_POINT_PTH_20X40MIL_2PIN]
U12  IC_OPAMP_TI_OPA363AIDBVR  [DBV6]
U13  IC_OPAMP_TI_OPA363AIDBVR  [DBV6]
U14  IC_OPAMP_TI_OPA363AIDBVR  [DBV6]
U15  IC_OPAMP_TI_OPA363AIDBVR  [DBV6]
U17  PIC18F6627T-E/PT  [TQFP64_10X10MC_MCH]
VPP!MCLR!  TST_POINT_PTH_20X40MIL_2PIN  [TST_POINT_PTH_20X40MIL_2PIN]

### Nets
5V: R42.1 ; also sheet 1
5V_MON: 5V2AD.P$1 5VMON.P$1 C45.1 R44.2 U17.16(RF2/AN7/C1OUT)
5V_OK: U17.1(RE1/!WR/P2C) ; also sheet 1
5VPIC: 5VSENS.P$1 5VSENS.P$2 C26.1 C41.1 C44.1 C46.1 C48.1 C50.1 C51.1 C52.1 C53.1 C77.1 C78.1 C79.1 PICKIT3.2 R1.1 R2.1 R3.1 R15.1 U12.5(EN) U12.6(V+) U13.5(EN) U13.6(V+) U14.5(EN) U14.6(V+) U15.5(EN) U15.6(V+) U17.10(VDD_2) U17.19(AVDD) U17.26(VDD_3) U17.38(VDD_4) U17.57(VDD) ; also sheet 1
12V_MON: 12V2AD.P$1 12VMON.P$1 C49.1 R50.2 U17.17(RF1/AN6/C2OUT)
!5V_EN!: !5VEN.P$1 !5VEN.P$2 U17.2(RE0/!RD/P2D) ; also sheet 1
!12V_EN!: !12VEN.P$1 U17.18(RF0/AN5) ; also sheet 1
!CHRGR_INT!: !INT!.P$2 R1.2 U17.33(RC2/ECCP1/P1A) ; also sheet 1
BUFFOUT1: R41.1 U12.1(VOUT) U12.4(IN-)
BUFFOUT2: R47.1 U14.1(VOUT) U14.4(IN-)
BUFFOUT3: R44.1 U13.1(VOUT) U13.4(IN-)
BUFFOUT4: R50.1 U15.1(VOUT) U15.4(IN-)
CHRGR_SCL: R2.2 SCL.P$2 U17.34(RC3/SCK1/SCL1) ; also sheet 1
CHRGR_SDA: R3.2 SDA.P$2 U17.35(RC4/SDI1/SDA1) ; also sheet 1
DCIN_MON: C42.1 DCIN2AD.P$1 DCINMON.P$1 R41.2 U17.27(RA5/AN4/HLVDIN)
DCIN_S: R39.1 ; also sheet 1
GND: C26.2 C41.2 C42.2 C44.2 C45.2 C46.2 C47.2 C48.2 C49.2 C50.2 C51.2 C52.2 C53.2 C77.2 C78.2 C79.2 PICKIT3.3 PICKITGND.P$1 PICKITGND.P$2 R7.2 R14.2 R40.2 R43.2 R45.2 R48.2 R51.2 R52.2 R53.2 U12.2(V-) U13.2(V-) U14.2(V-) U15.2(V-) U17.9(VSS_2) U17.20(AVSS) U17.25(VSS_3) U17.41(VSS_4) U17.56(VSS) ; also sheet 1
IB_PWR_EN: U17.15(RF3/AN8) ; also sheet 1
IB_SPI_!SS: U17.49(RD7/PSP7/!SS2) ; also sheet 1
IB_SPI_MISO: U17.52(RD4/PSP4/SDO2) ; also sheet 1
IB_SPI_MOSI: U17.51(RD5/PSP5/SDI2/SDA2) ; also sheet 1
IB_SPI_SCLK: U17.50(RD6/PSP6/SCK2/SCL2) ; also sheet 1
N$9: RG0.P$1 U17.3(RG0/ECCP3/P3A)
N$25: SCL.P$1
N$27: !INT!.P$1
N$31: SDA.P$1
N$37: RG1.P$1 U17.4(RG1/TX2/CK2)
N$38: RF4.P$1 U17.14(RF4/AN9)
N$42: R39.2 R40.1 U12.3(IN+)
N$43: R42.2 R43.1 U13.3(IN+)
N$44: R45.1 R46.2 U14.3(IN+)
N$45: R48.1 R49.2 U15.3(IN+)
N$46: RC7.P$1 U17.32(RC7/RX1/DT1)
N$58: PTH1.P$1 R7.1
N$59: PTH2.P$1 R14.1
N$60: PTH3.P$1 R51.1
N$61: PTH4.P$1 R52.1
N$62: PTH5.P$1 R53.1
PC_PWR_12V: R49.1 ; also sheet 1
PICKIT3_PGC: PICKIT3.5 PICPGC.P$1 PICPGC.P$2 U17.42(RB6/KBI2/PGC)
PICKIT3_PGD: PICKIT3.4 PICPGD.P$1 PICPGD.P$2 U17.37(RB7/KBI3/PGD)
PSW_MON: C47.1 PSW2AD.P$1 PSWMON.P$1 R47.2 U17.24(RA0/AN0)
PSW_OUT: R46.1 ; also sheet 1
STAT_LED_!RED!/GRN: U17.47(RB1/INT1) ; also sheet 1
STAT_LED_RED/!GRN!: U17.48(RB0/INT0) ; also sheet 1
VBATSW_EN: U17.46(RB2/INT2) ; also sheet 1
VPP_!MCLR!: PICKIT3.1 R15.2 U17.7(!MCLR/VPP/RG5) VPP!MCLR!.P$1 VPP!MCLR!.P$2
Unconnected: PICKIT3.6 U17.5(RG2/RX2/DT2) U17.6(RG3/CCP4/P3D) U17.8(RG4/CCP5/P1D) U17.11(RF7/!SS1) U17.12(RF6/AN11) U17.13(RF5/AN10/CVREF) U17.21(RA3/AN3/VREF+) U17.22(RA2/AN2/VREF-) U17.23(RA1/AN1) U17.28(RA4/T0CKI) U17.29(RC1/T1OSI/ECCP2/P2A) U17.30(RC0/T1OSO/T13CKI) U17.31(RC6/TX1/CK1) U17.36(RC5/SDO1) U17.39(OSC1/CLKI/RA7) U17.40(OSC2/CLKO/RA6) U17.43(RB5/KBI1/PGM) U17.44(RB4/KBI0) U17.45(RB3/INT3) U17.53(RD3/PSP3) U17.54(RD2/PSP2) U17.55(RD1/PSP1) U17.58(RD0/PSP0) U17.59(RE7/ECCP2/P2A) U17.60(RE6/P1B) U17.61(RE5/P1C) U17.62(RE4/P3B) U17.63(RE3/P3C) U17.64(RE2/!CS/P2B)

### Notes on the sheet
- POWER BOARD CONTROLLER
- PIN 57
- Senses presence of 5V target power.
  Powers target if it is not self-powering.
- NC
- PICKIT3    DESC.
  ---------   ---------------------
      1          VPP / !MCLR
      2          VDD Target Sense
      3          VSS GND
      4          ICSPDAT / PGD  (data)
      5          ICSPCLK / PGC  (clock)
      6          LVP
- TO/FROM J4 IB INTFC
  (SH. 1)
- CONNECTION MISSING
  FROM 1700-0003_PowerBoard
  (v1) DESIGN.   2/23/23, -sjp
- no pin connections req'd
  for internal oscillator mode
- PIN 10
- PIN 38
- GPIO assignments subject
  to change @ layout
- TO/FROM U1 CHARGER
  (SH. 1)
- POWER BOARD CONN SUMMARY
- CONN
  -----
  J1
  J2
  J3
  J4
  J5
- FUNC
  -------------------------------
  (IN) BATTERY PACK
  (IN) CHARGER PWR
  (IN/OUT) PWR SW / LEDs
  (OUT, DATA) INTFC BRD PWR + COMM
  (OUT) PANEL PC PWR
- PIN 26
- MOUNTING HOLES (4-40 panheads)
  & CHASSIS - GND JUMPERS
- ESD
- VOLTAGE RAIL MONITORING
  (BUFFER CKTS)
- ADC Full Scale
  -----------------
  2^12 = 4096
  Max Val. = 4095 == 5017mV = 5.017V
  (1.225mV/count)
- 4-40 Panhead Mounting Holes
- DC_IN BUFFER
- (CHARGER SUPPLY AFTER REV. POLARITY PROTECTION) | PWR SWITCH OUTPUT BUFFER | 5V BUFFER | 12V BUFFER
- AC/DC adapter
  +/- 4%
- DCIN    DCIN_MON
  --------  --------------
  12.5V    3125mV
  12.0V    3000mV
  11.5V    2875mV
  
  Ag = 0.25
- 5V RAIL    V(IN+)
  ---------    ----------
  5.1V         3060mV
  5.0V         3000mV
  4.9V         2940mV
  
  Ag = 0.6
- 12V      12V_MON
  -------    ------------
  12.1V      3025mV
  12.0V      3000mV
  11.9V      2975mV
  
  Ag = 0.25
- PSW_OUT      V(IN+)
  ----------   ----------
  8.4V          2999mV
  6.0V          2142mV
  
  Ag = 0.357
- changed from BATT+
  (12/20/22)
- scope | scope | scope | scope
- pogo | pogo | pogo | pogo
- f(c) = 15.9KHz | f(c) = 15.9KHz | f(c) = 15.9KHz | f(c) = 15.9KHz

## Library data of the parts
5V 5VMON 5VPIC 12V 12VMON BATT+ BATT-(GND) DCIN_S DCINMON GND IBPWREN PSWMON PSWOUT RC7 RF4 RG0 RG1 THERM+ THERM- VBAT_SW VBATSWEN VCHRG = TTECH:TST_POINT_PTH_042-OCT; PART_DESC: PCB feature, test point, ID 42mil, OD 72mil
5V2AD 5VIB 5VTP 12V2AD 12VTP !12VEN DCIN2AD LEDBLK LEDRED PSW2AD U1REF U1VL = TTECH:TST_POINT_PTH_20X40MIL
5VOK 5VSENS !5VEN !INT! PICKITGND PICPGC PICPGD SCL SDA VPP!MCLR! = TTECH:TST_POINT_PTH_20X40MIL_2PIN; PART_DESC: PCB FEATURE, TEST POINT, ID 20MIL, OD 40MIL
5VON 12VON PICPWR = TTECH:LED_0603; COPYRIGHT: Copyright (C) 2022 Ultra Librarian. All rights reserved.; MANUFACTURER: DIALIGHT; MANUFACTURER_PART_NUMBER: 598-8081-107F; PART_DESC: LED GREEN CLEAR 0603 SMD
!SPI_SS! MISO MOSI SPI_CLK = TTECH:TST_POINT_PTH_042_2PIN; PART_DESC: PCB feature, test point, ID 42mil, OD 72mil
C1 = TTECH:CAP_CER_0603_TDK; MANUFACTURER: SAMSUNG; MANUFACTURER_PART_NUMBER: CL10C221JB8NNNC; PART_DESC: CAP CER 220PF 50V C0G/NP0 0603
C2 C4 = TTECH:CAP_CER_0603_TDK; MANUFACTURER: MURATA; MANUFACTURER_PART_NUMBER: GRM188Z71C475KE21D; PART_DESC: CAP CER 4.7UF 16V X7R 0603
C3 = TTECH:CAP_CER_1206_SAMSUNG; COPYRIGHT: Copyright (C) 2022 Ultra Librarian. All rights reserved.; MANUFACTURER: SAMSUNG; MANUFACTURER_PART_NUMBER: CL31A226KAHNNNE; PART_DESC: CAP CER 22UF 25V X5R 1206
C5 C33 = TTECH:CAP_CER_1206_SAMSUNG; COPYRIGHT: Copyright (C) 2022 Ultra Librarian. All rights reserved.; MANUFACTURER: SAMSUNG; MANUFACTURER_PART_NUMBER: CL31A226KAHNNNE; PART_DESC: CAP CER 22UF 25V X5R 1206; QTY_AREA: (2X)
C6 = TTECH:CAP_SMT_EL_CORNELL-DUB_AFK106M25B12T-F; COPYRIGHT: Copyright (C) 2023 Ultra Librarian. All rights reserved.; MANUFACTURER: Cornell Dubilier; MANUFACTURER_PART_NUMBER: AFK106M25B12T-F; PART_DESC: CAP ALUM 10UF 20% 25V SMD
C7 C14 = TTECH:CAP_CER_0603_TDK; MANUFACTURER: SAMSUNG; MANUFACTURER_PART_NUMBER: CL10B104KB8NNNC; PACKAGE: (0603); PART_DESC: CAP CER 0.1UF 50V X7R 0603
C8 C11 C15 C16 C18 C19 C26 C32 C39 C41 C44 C46 C48 C50 C52 C78 = TTECH:CAP_CER_0402_MURATA; MANUFACTURER: MURATA; MANUFACTURER_PART_NUMBER: GCM155R71C104KA55D; PART_DESC: CAP CER 0.1UF 16V X7R 0402
C9 = TTECH:CAP_CER_0402_MURATA; MANUFACTURER: MURATA; MANUFACTURER_PART_NUMBER: C0402C473K3REC7867; PART_DESC: CAP CER 0402 47NF 25V X7R 10%
C12 = TTECH:CAP_CER_0402_MURATA; MANUFACTURER: MURATA; MANUFACTURER_PART_NUMBER: C0402C223K5REC7411; PART_DESC: CAP CER 0402 22NF 50V X7R 10%
C13 = TTECH:CAP_CER_0603_TDK; MANUFACTURER: SAMSUNG; MANUFACTURER_PART_NUMBER: CL10B105KA8NNNC; PACKAGE: (0603); PART_DESC: CAP CER 1UF 25V X7R 0603
C17 = TTECH:CAP_TANT_KEMET_2917; COPYRIGHT: Copyright (C) 2022 Ultra Librarian. All rights reserved.; MANUFACTURER: KEMET; MANUFACTURER_PART_NUMBER: T495D226K035ATE300; PART_DESC: CAP TANT 22UF 10% 35V 2917
C20 = TTECH:CAP_TANTALUM_KEMET_T495D; COPYRIGHT: Copyright (C) 2022 Ultra Librarian. All rights reserved.; MANUFACTURER: KEMET; MANUFACTURER_PART_NUMBER: T495D476K025ATE250; PART_DESC: CAP TANT 47UF 10% 25V 2917
C21 = TTECH:CAP_CER_1206_SAMSUNG; COPYRIGHT: Copyright (C) 2022 Ultra Librarian. All rights reserved.; MANUFACTURER: SAMSUNG; MANUFACTURER_PART_NUMBER: CL31B106KBHNNNE; PART_DESC: CAP CER 10UF 50V X7R 1206; QTY_AREA: (__X)
C22 = TTECH:CAP_CER_0402_MURATA; MANUFACTURER: MURATA; MANUFACTURER_PART_NUMBER: GRM155R71E223KA61D; PART_DESC: Multilayer Ceramic Capacitors MLCC - SMD/SMT .022UF 25V 10% 0402
C23-C25 = TTECH:CAP_CER_1206_SAMSUNG; COPYRIGHT: Copyright (C) 2022 Ultra Librarian. All rights reserved.; MANUFACTURER: SAMSUNG; MANUFACTURER_PART_NUMBER: GCM31CC81E226KE11L; PART_DESC: CAP CER 22UF 25V X6S 1206; QTY_AREA: (3X)
C27 = TTECH:CAP_CER_0402_MURATA; MANUFACTURER: MURATA; PART_DESC: --- DO NOT POPULATE ---
C28 = TTECH:CAP_CER_0402_MURATA; MANUFACTURER: MURATA; MANUFACTURER_PART_NUMBER: GRM155R61E105KA12D; PART_DESC: CAP CER 1UF 25V X5R 0402
C29 = TTECH:CAP_CER_0402_MURATA; MANUFACTURER: MURATA; MANUFACTURER_PART_NUMBER: C0402C120K5RAC7867; PART_DESC: CAP CER 12PF 50V X7R 0402
C30 = TTECH:CAP_CER_TDK_CKG57; COPYRIGHT: Copyright (C) 2022 Ultra Librarian. All rights reserved.; MANUFACTURER: TDK; MANUFACTURER_PART_NUMBER: CKG57NX7R1H476M500JH; PART_DESC: 47 µF ±20% 50V Ceramic Capacitor X7R Stacked SMD, 2 J-Lead; QTY_AREA: (2X)
C31 = TTECH:CAP_CER_TDK_CKG57; COPYRIGHT: Copyright (C) 2022 Ultra Librarian. All rights reserved.; MANUFACTURER: TDK; MANUFACTURER_PART_NUMBER: CKG57NX7R1H476M500JH; PACKAGE: (SMD-MLCC); PART_DESC: 47 µF ±20% 50V Ceramic Capacitor X7R Stacked SMD, 2 J-Lead; QTY_AREA: (2X)
C36 = TTECH:CAP_CER_0402_MURATA; MANUFACTURER: MURATA; MANUFACTURER_PART_NUMBER: GRM155C81C225ME15D; PART_DESC: CAP CER 2.2UF 16V X6S 0402
C42 C45 C47 C49 = TTECH:CAP_CER_0603_TDK; MANUFACTURER: KEMET; MANUFACTURER_PART_NUMBER: C0603C104K3RAC7867; PART_DESC: CAP CER 0.1UF 25V X7R 0603
C43 C51 C53 C77 C79 = TTECH:CAP_CER_0603_TDK; MANUFACTURER: MURATA; MANUFACTURER_PART_NUMBER: GRM188D71A106KA73D; PART_DESC: CAP CER 10UF 10V X7T 0603
CR1 CR4 = TTECH:DIODE_SMA; COPYRIGHT: Copyright (C) 2022 Ultra Librarian. All rights reserved.; MANUFACTURER: DIODES INC.; MANUFACTURER_PART_NUMBER: ES1A-13-F; PART_DESC: DIODE GEN PURP 50V 1A SMA
CR2 CR3 = TTECH:DIODE_SCHOTTKY_SMC; COPYRIGHT: Copyright (C) 2022 Ultra Librarian. All rights reserved.; MANUFACTURER: DIODES INC.; MANUFACTURER_PART_NUMBER: B560CQ-13-F; PART_DESC: DIODE SCHOTTKY 60V 5A SMC; QTY_AREA: (2X)
CR5 = TTECH:DIODE_ZENER_VISHAY_BZD27C4V3P-E3-08; COPYRIGHT: Copyright (C) 2022 Ultra Librarian. All rights reserved.; MANUFACTURER: VISHAY; MANUFACTURER_PART_NUMBER: BZD27C4V3P-E3-08; PART_DESC: DIODE ZENER 4.3V 800MW DO219AB
CR6 CR7 = TTECH:DIODE_SCHOTTKY_TOSHIBA_1SS404; COPYRIGHT: Copyright (C) 2022 Ultra Librarian. All rights reserved.; MANUFACTURER: TOSHIBA; MANUFACTURER_PART_NUMBER: 1SS404; PART_DESC: DIODE SCHOTTKY 20V 300MA USC
J1 = TTECH:MOLEX_MINI-FIT-JR_462075004; MANUFACTURER: MOLEX; MANUFACTURER_PART_NUMBER: 0462075004; PART_DESC: MINI-FIT JR LCP VERT. HDR PEGS 4
J2 = TTECH:MOLEX_NANO-FIT_1053111302; COPYRIGHT: Copyright (C) 2022 Ultra Librarian. All rights reserved.; MANUFACTURER: MOLEX; MANUFACTURER_PART_NUMBER: 1053111302; PART_DESC: CONN HEADER VERT 2POS 2.5MM
J3 = TTECH:MOLEX_NANO-FIT_1053111304; MANUFACTURER: MOLEX; MANUFACTURER_PART_NUMBER: 1053111304; PART_DESC: HEADER, NANOFIT, VERT, 4 POS 2.5mm
J4 = TTECH:MOLEX_1053111206; COPYRIGHT: Copyright (C) 2022 Ultra Librarian. All rights reserved.; MANUFACTURER: MOLEX; MANUFACTURER_PART_NUMBER: 1053111206; PART_DESC: CONN HEADER VERT 6POS 2.5MM
J5 = TTECH:MOLEX_NANO-FIT_1053111303; COPYRIGHT: Copyright (C) 2022 Ultra Librarian. All rights reserved.; MANUFACTURER: MOLEX; MANUFACTURER_PART_NUMBER: 1053111303; PART_DESC: CONN HEADER VERT 3POS 2.5MM
J6 = TTECH:CON_MOLEX_NANOFIT_1053121304; MANUFACTURER: MOLEX; MANUFACTURER_PART_NUMBER: 1053121304; PART_DESC: CONN HEADER VERT 4POS 2.5MM
L1 = TTECH:INDUCTOR_COILCRAFT_XAL5030; COPYRIGHT: Copyright (C) 2022 Ultra Librarian. All rights reserved.; MANUFACTURER: COILCRAFT; MANUFACTURER_PART_NUMBER: XAL5030-122MEC; PART_DESC: Fixed Inductors 1.2uH Shld 20% 11.1A 9.4mOhms AECQ2
L2 = TTECH:INDUCTOR_PWR_EATON_DR127-220-R; COPYRIGHT: Copyright (C) 2022 Ultra Librarian. All rights reserved.; MANUFACTURER: EATON; MANUFACTURER_PART_NUMBER: DR127-220-R; PART_DESC: FIXED IND 22UH 4A 39.1 MOHM SMD
L3 = TTECH:INDUCTOR_EATON_DRA74; COPYRIGHT: Copyright (C) 2022 Ultra Librarian. All rights reserved.; MANUFACTURER: EATON; MANUFACTURER_PART_NUMBER: DRA74-3R3-R; PART_DESC: FIXED IND 3.3UH 4.16A 16MOHM SMD
PICKIT3 = TTECH:CON_6POS_VERT-HDR_AMPH_10129378-906001; MANUFACTURER: AMPHENOL; MANUFACTURER_PART_NUMBER: 10129378-906001BLF; PART_DESC: Connector Header Through Hole 6 position 0.100" (2.54mm)
PTH1-PTH5 = TTECH:PTH_4-40; PART_DESC: PCB feature, PTH 4-40, ID 148mil, OD 220mil
Q1 Q2 = TTECH:MOSFET_N-CH_DIODES-INC_DMS3015SSS-13: ENHANCEMENT MODE MOSFET; MANUFACTURER: DIODES INC.; MANUFACTURER_PART_NUMBER: DMS3015SSS-13; PART_DESC: N-Channel 30 V 11A (Ta) 1.55W (Ta) Surface Mount 8-SO
Q3 Q5 Q8 = TTECH:MOSFET_P-CH_ALPHA&OMEGA_AO4485: Transistor: P-MOSFET; unipolar; -40V; -8A; 1.1W; SO8; MANUFACTURER: ALPHA & OMEGA; MANUFACTURER_PART_NUMBER: AO4485; PART_DESC: MOSFET P-CH 40V 10A 8SOIC
Q4 = TTECH:TRANS_PNP_SOT-23-3_DIOTEC; MANUFACTURER: DIOTEC; MANUFACTURER_PART_NUMBER: BC807-40; PART_DESC: Bipolar Transistors - BJT Bipolar Transistor, SOT-23, 45V, 800mA, PNP
Q6 = TTECH:MOSFET_P-CH_VISHAY_SI7145DP-T1-GE3; MANUFACTURER: VISHAY; MANUFACTURER_PART_NUMBER: SI7145DP-T1-GE3; PART_DESC: MOSFET P-CH 30V 60A PPAK SO-8
Q7 Q9-Q11 = TTECH:MMBT2222ATT3G; MANUFACTURER: ONSEMI; MANUFACTURER_PART_NUMBER: MMBT2222ATT3G; PART_DESC: TRANS NPN 40V 0.6A SC75 SOT416
R1-R4 R8-R10 R15 R21 R25 R27 R29 R35-R37 R58 R59 R61 R62 = TTECH:RES_0402_VISHAY: RES SMD ... 0402; MANUFACTURER: VISHAY; MANUFACTURER_PART_NUMBER: CRCW040210K0FKEDC; PART_DESC: RES 10K OHM 1% 1/16W 0402
R5 = TTECH:RES_0402_VISHAY: RES SMD ... 0402; MANUFACTURER: STACKPOLE; MANUFACTURER_PART_NUMBER: RMCF0402FT133K; PART_DESC: RES 133K OHM 1% 1/16W 0402
R6 = TTECH:RES_0402_VISHAY: RES SMD ... 0402; MANUFACTURER: TECONN; MANUFACTURER_PART_NUMBER: CPF0402B86K6E1; PART_DESC: RES SMD 86.6KOHM 0.1% 1/16W 0402
R7 R14 R19 R51-R54 R57 = TTECH:RES_0805_STACKPOLE; COPYRIGHT: Copyright (C) 2022 Ultra Librarian. All rights reserved.; MANUFACTURER: STACKPOLE; MANUFACTURER_PART_NUMBER: HCJ0805ZT0R00; PART_DESC: RES 0 OHM JUMPER 1/2W 0805
R11 = TTECH:RES_0402_VISHAY: RES SMD ... 0402; MANUFACTURER: VISHAY; MANUFACTURER_PART_NUMBER: CRCW0402174KFKTD; PART_DESC: Thick Film Resistors - SMD 1/16watt 174Kohms 1%
R12 = TTECH:RES_0402_VISHAY: RES SMD ... 0402; MANUFACTURER: YAGEO; MANUFACTURER_PART_NUMBER: RC0402FR-07178KL; PART_DESC: RES 178K OHM 1% 1/16W 0402
R13 = TTECH:RES_0402_VISHAY: RES SMD ... 0402; MANUFACTURER: VISHAY; MANUFACTURER_PART_NUMBER: CRCW0402732KFKED; PART_DESC: Thick Film Resistors - SMD 1/16watt 732Kohms 1%
R16 R20 = TTECH:RES_0402_VISHAY: RES SMD ... 0402; MANUFACTURER: VISHAY; MANUFACTURER_PART_NUMBER: CRCW040210R0FKEDC; PART_DESC: RES 10 OHM 1% 1/16W 0402
R17 R18 = TTECH:RES_2512_TECONN; MANUFACTURER: TECONN; MANUFACTURER_PART_NUMBER: TLRP3A20CR090FTE; PART_DESC: RES 0.09 OHM 1% 2W 2512; QTY_AREA: (2X)
R22 = TTECH:RES_0402_VISHAY: RES SMD ... 0402; MANUFACTURER: VISHAY; MANUFACTURER_PART_NUMBER: CRCW040280K6FKED; PART_DESC: RES SMD 80.6K OHM 1% 1/16W 0402
R23 = TTECH:RES_0402_VISHAY: RES SMD ... 0402; MANUFACTURER: VISHAY; MANUFACTURER_PART_NUMBER: MCS0402MD4993BE000; PACKAGE: (0402); PART_DESC: MCS 0402-25 0.1% AT E0 499K
R24 = TTECH:RES_0402_VISHAY: RES SMD ... 0402; MANUFACTURER: VISHAY; MANUFACTURER_PART_NUMBER: TNPW040295K3BEED; PACKAGE: (0402); PART_DESC: RES 95.3K OHM 0.1% 1/16W 0402
R26 R56 = TTECH:RES_0603_STACKPOLE; COPYRIGHT: Copyright (C) 2022 Ultra Librarian. All rights reserved.; MANUFACTURER: STACKPOLE; MANUFACTURER_PART_NUMBER: RMCF0603FT1K15; PACKAGE: (0603); PART_DESC: RES 1.15K OHM 1% 1/10W 0603
R28 R38 R60 R63 = TTECH:RES_0402_VISHAY: RES SMD ... 0402; MANUFACTURER: VISHAY; MANUFACTURER_PART_NUMBER: CRCW04021K00FKEDC; PART_DESC: RES 1K OHM 1% 1/16W 0402
R30 R40 R42 R45 R48 = TTECH:RES_0603_STACKPOLE; COPYRIGHT: Copyright (C) 2022 Ultra Librarian. All rights reserved.; MANUFACTURER: STACKPOLE; MANUFACTURER_PART_NUMBER: RNCS0603BKE10K0; PACKAGE: (0603); PART_DESC: RES 10K OHM 0.1% 1/16W 0603
R31 = TTECH:RES_0402_VISHAY: RES SMD ... 0402; MANUFACTURER: ---; MANUFACTURER_PART_NUMBER: ---; PART_DESC: DNP - RES 0402
R39 R49 = TTECH:RES_0603_STACKPOLE; COPYRIGHT: Copyright (C) 2022 Ultra Librarian. All rights reserved.; MANUFACTURER: TECONN; MANUFACTURER_PART_NUMBER: CPF0603B30KE1; PACKAGE: (0603); PART_DESC: RES SMD 30K OHM 0.1% 1/16W 0603
R41 R44 R47 R50 = TTECH:RES_0603_STACKPOLE; COPYRIGHT: Copyright (C) 2022 Ultra Librarian. All rights reserved.; MANUFACTURER: TECONN; MANUFACTURER_PART_NUMBER: CPF0603F100RC1; PACKAGE: (0603); PART_DESC: RES SMD 100 OHM 1% 1/16W 0603
R43 = TTECH:RES_0603_STACKPOLE; COPYRIGHT: Copyright (C) 2022 Ultra Librarian. All rights reserved.; MANUFACTURER: TECONN; MANUFACTURER_PART_NUMBER: CPF0603B15KE1; PACKAGE: (0603); PART_DESC: RES SMD 15K OHM 0.1% 1/16W 0603
R46 = TTECH:RES_0603_STACKPOLE; COPYRIGHT: Copyright (C) 2022 Ultra Librarian. All rights reserved.; MANUFACTURER: TECONN; MANUFACTURER_PART_NUMBER: CPF0603B18KE1; PACKAGE: (0603); PART_DESC: RES SMD 18K OHM 0.1% 1/16W 0603
R55 = TTECH:RES_1206_YAGEO; COPYRIGHT: Copyright (C) 2022 Ultra Librarian. All rights reserved.; MANUFACTURER: VISHAY; MANUFACTURER_PART_NUMBER: CRCW12064K64FKEAC; PACKAGE: (1206); PART_DESC: RES 4.64K OHM 1% 1/4W 1206
U1 = TTECH:MAX1647EAP+; MANUFACTURER: MAXIM; MANUFACTURER_PART_NUMBER: MAX1647EAP+; PART_DESC: IC BATT CHG MULTI-CHEM 20SSOP
U3 = TTECH:AD_REFERENCE_ADR364AUJZ-REEL7; MANUFACTURER: AD; MANUFACTURER_PART_NUMBER: ADR364AUJZ-REEL7; PART_DESC: Series Voltage Reference IC Fixed 4.096V V ±0.2% 5 mA TSOT-23-5
U4 = TTECH:REGULATOR_BOOST_TI_TPS61178RNWT; COPYRIGHT: Copyright (C) 2022 Ultra Librarian. All rights reserved.; MANUFACTURER: TI; MANUFACTURER_PART_NUMBER: TPS61178RNWT; PART_DESC: IC REG BOOST ADJ 10A 13VQFN
U5 = TTECH:REGULATOR_BUCK_RENESAS_ISL85005AFRZ-T7A: RENESAS - ISL85005AFRZ-T7A - DC/DC CONV, SYNC BUCK, DFN-12 Source: Datasheet <https://www.renesas.com/eu/en/www/doc/datasheet/isl85005-05a.pdf> Check availability <https://pricing.snapeda.com/parts/ISL85005AFRZ-T7A/Renesas%20Electronics%20America%20Inc/view-part?ref=eda>; MANUFACTURER: RENESAS (INTERSIL); MANUFACTURER_PART_NUMBER: ISL85005AFRZ-T7A; PART_DESC: Buck Switching Regulator IC Positive Adjustable 5V 1 Output 5A 12-VFDFN Exposed Pad
U6 = TTECH:IC_LDO_STM_LD2981CM50TR; COPYRIGHT: Copyright (C) 2022 Ultra Librarian. All rights reserved.; MANUFACTURER: STM; MANUFACTURER_PART_NUMBER: LD2981CM50TR; PART_DESC: Linear Voltage Regulator IC Positive Fixed 1 Output 100mA SOT-23-5
U7 = TTECH:IC_H-BRIDGE_TI_DRV8220DRLR; MANUFACTURER: TI; MANUFACTURER_PART_NUMBER: DRV8220DRLR; PART_DESC: 20-V, 1-A H-BRIDGE MOTOR DRIVER
U12-U15 = TTECH:IC_OPAMP_TI_OPA363AIDBVR; COPYRIGHT: Copyright (C) 2022 Ultra Librarian. All rights reserved.; MANUFACTURER: TI; MANUFACTURER_PART_NUMBER: OPA363AIDBVR; PACKAGE: (SOT23-6); PART_DESC: IC OPAMP GP 1 CIRCUIT SOT23-6
U17 = TTECH:PIC18F6627T-E/PT; MANUFACTURER: MICROCHIP; MANUFACTURER_PART_NUMBER: PIC18F6627T-E/PT; PART_DESC: IC MCU 8BIT 96KB FLASH 64TQFP

## Net classes
0 default: width 0.152 mm, drill 0.203 mm, clearance 0.254 mm